# EasyEDA Pro project ProDoc_EthernetSwitch_2026-02-25.epro, board EthernetSwitch
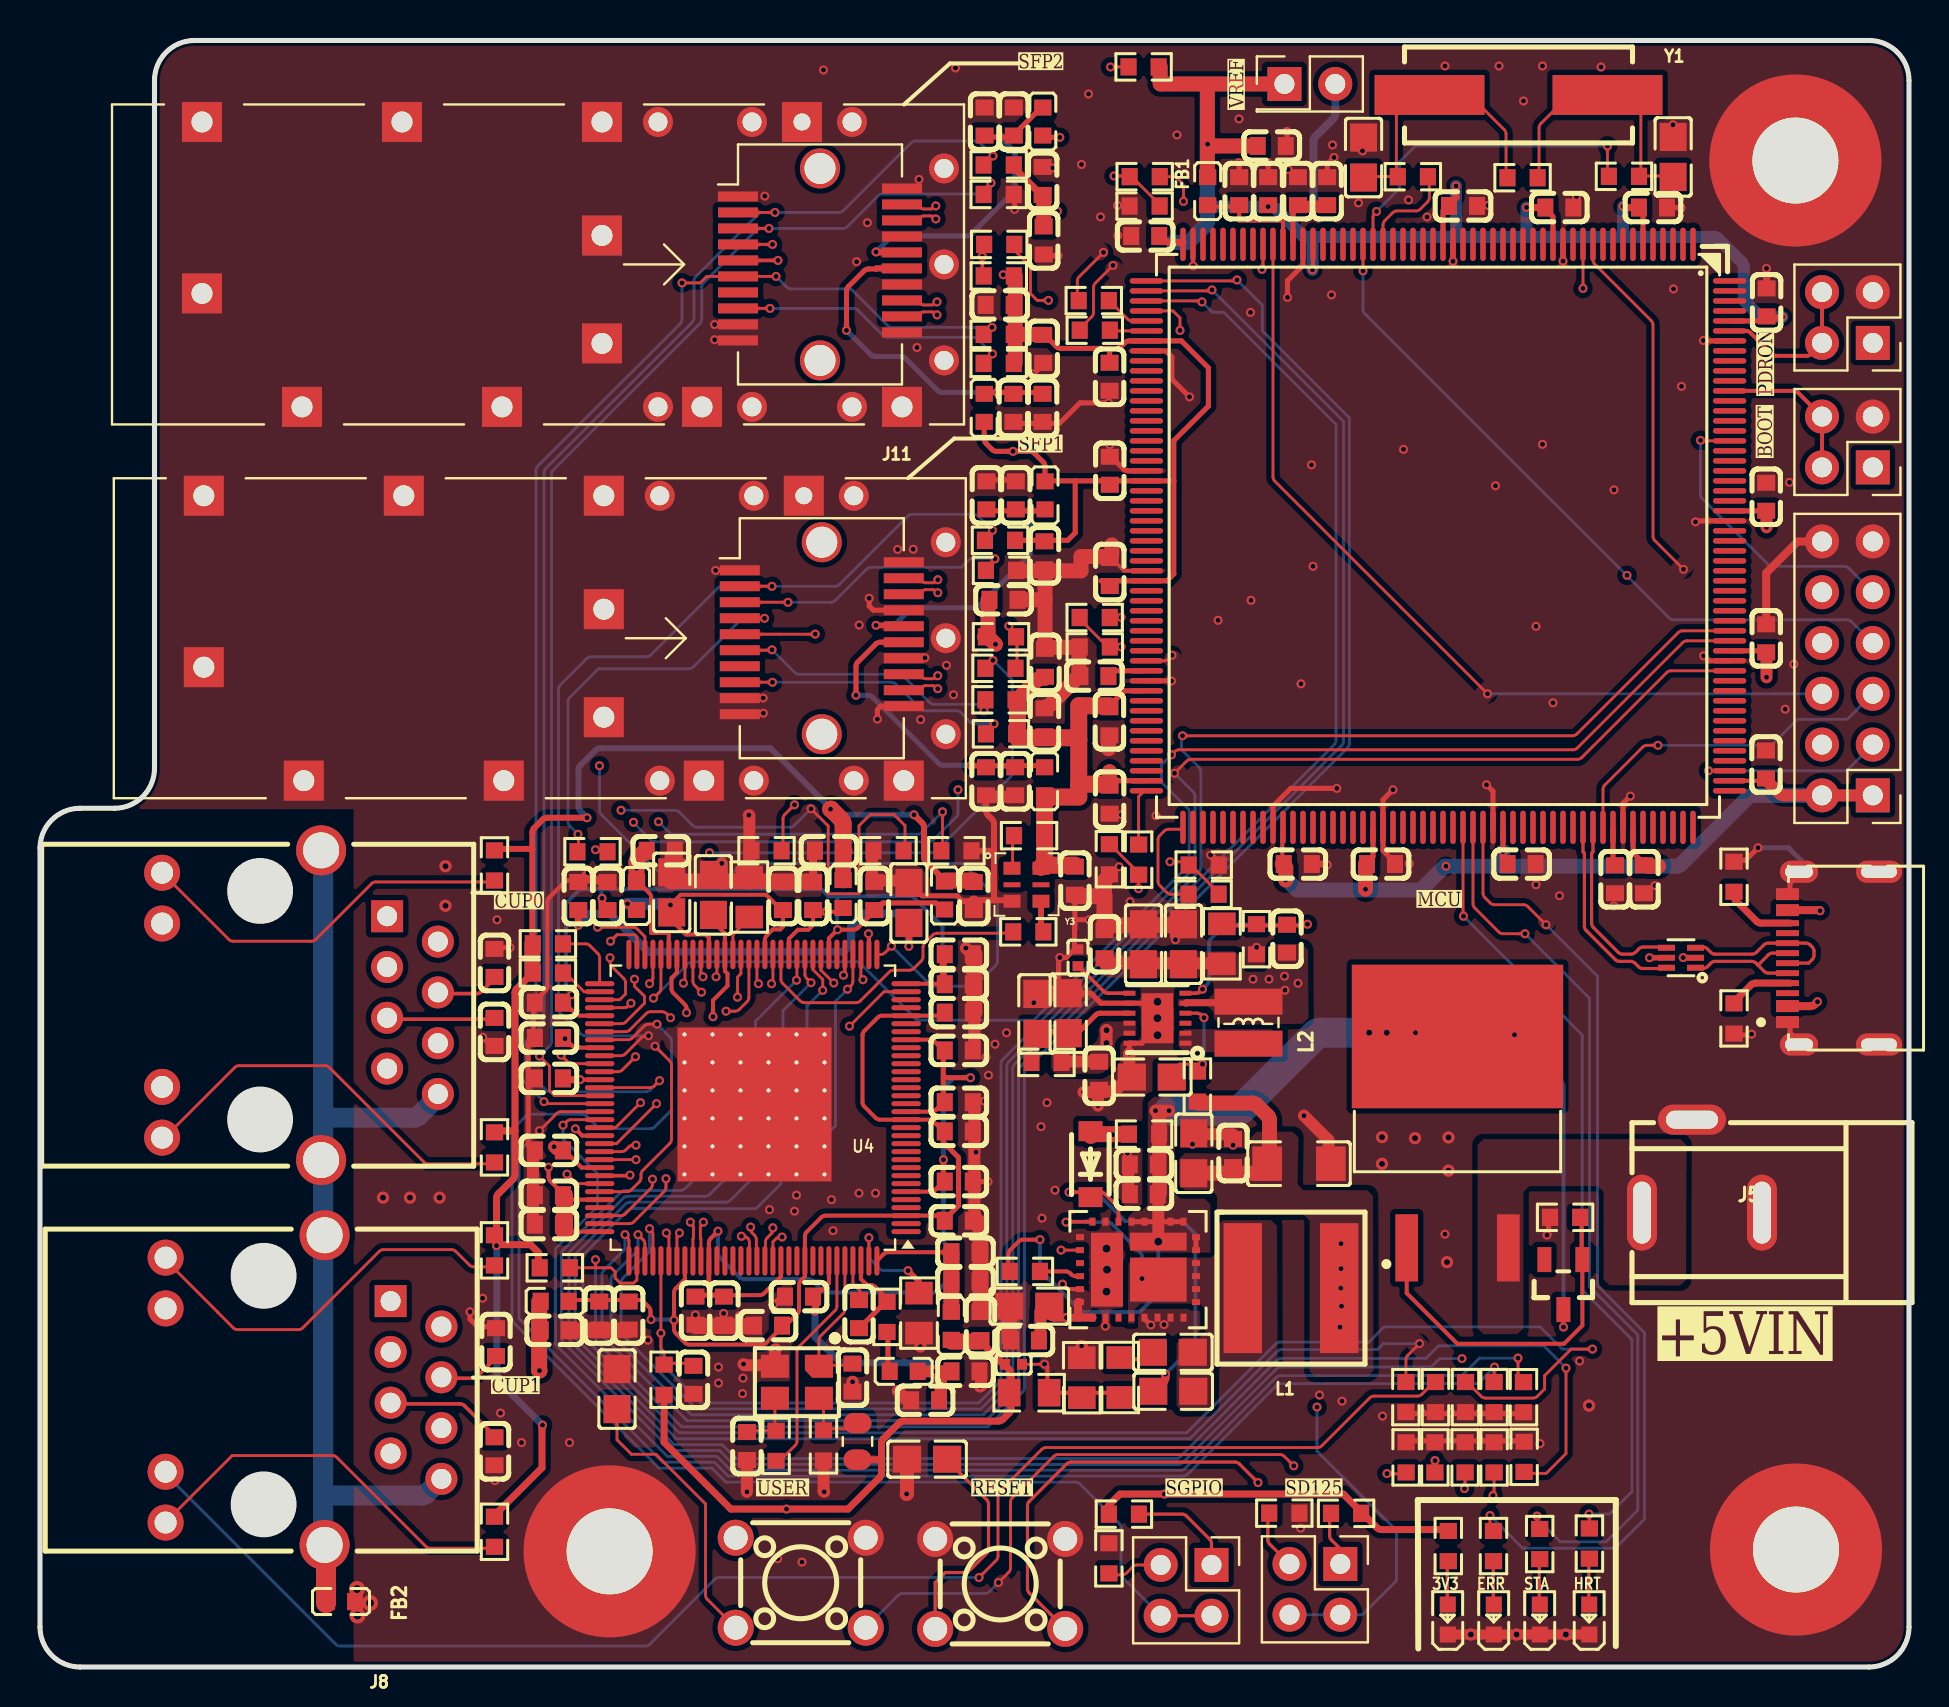
[diagram p3: board, top side]
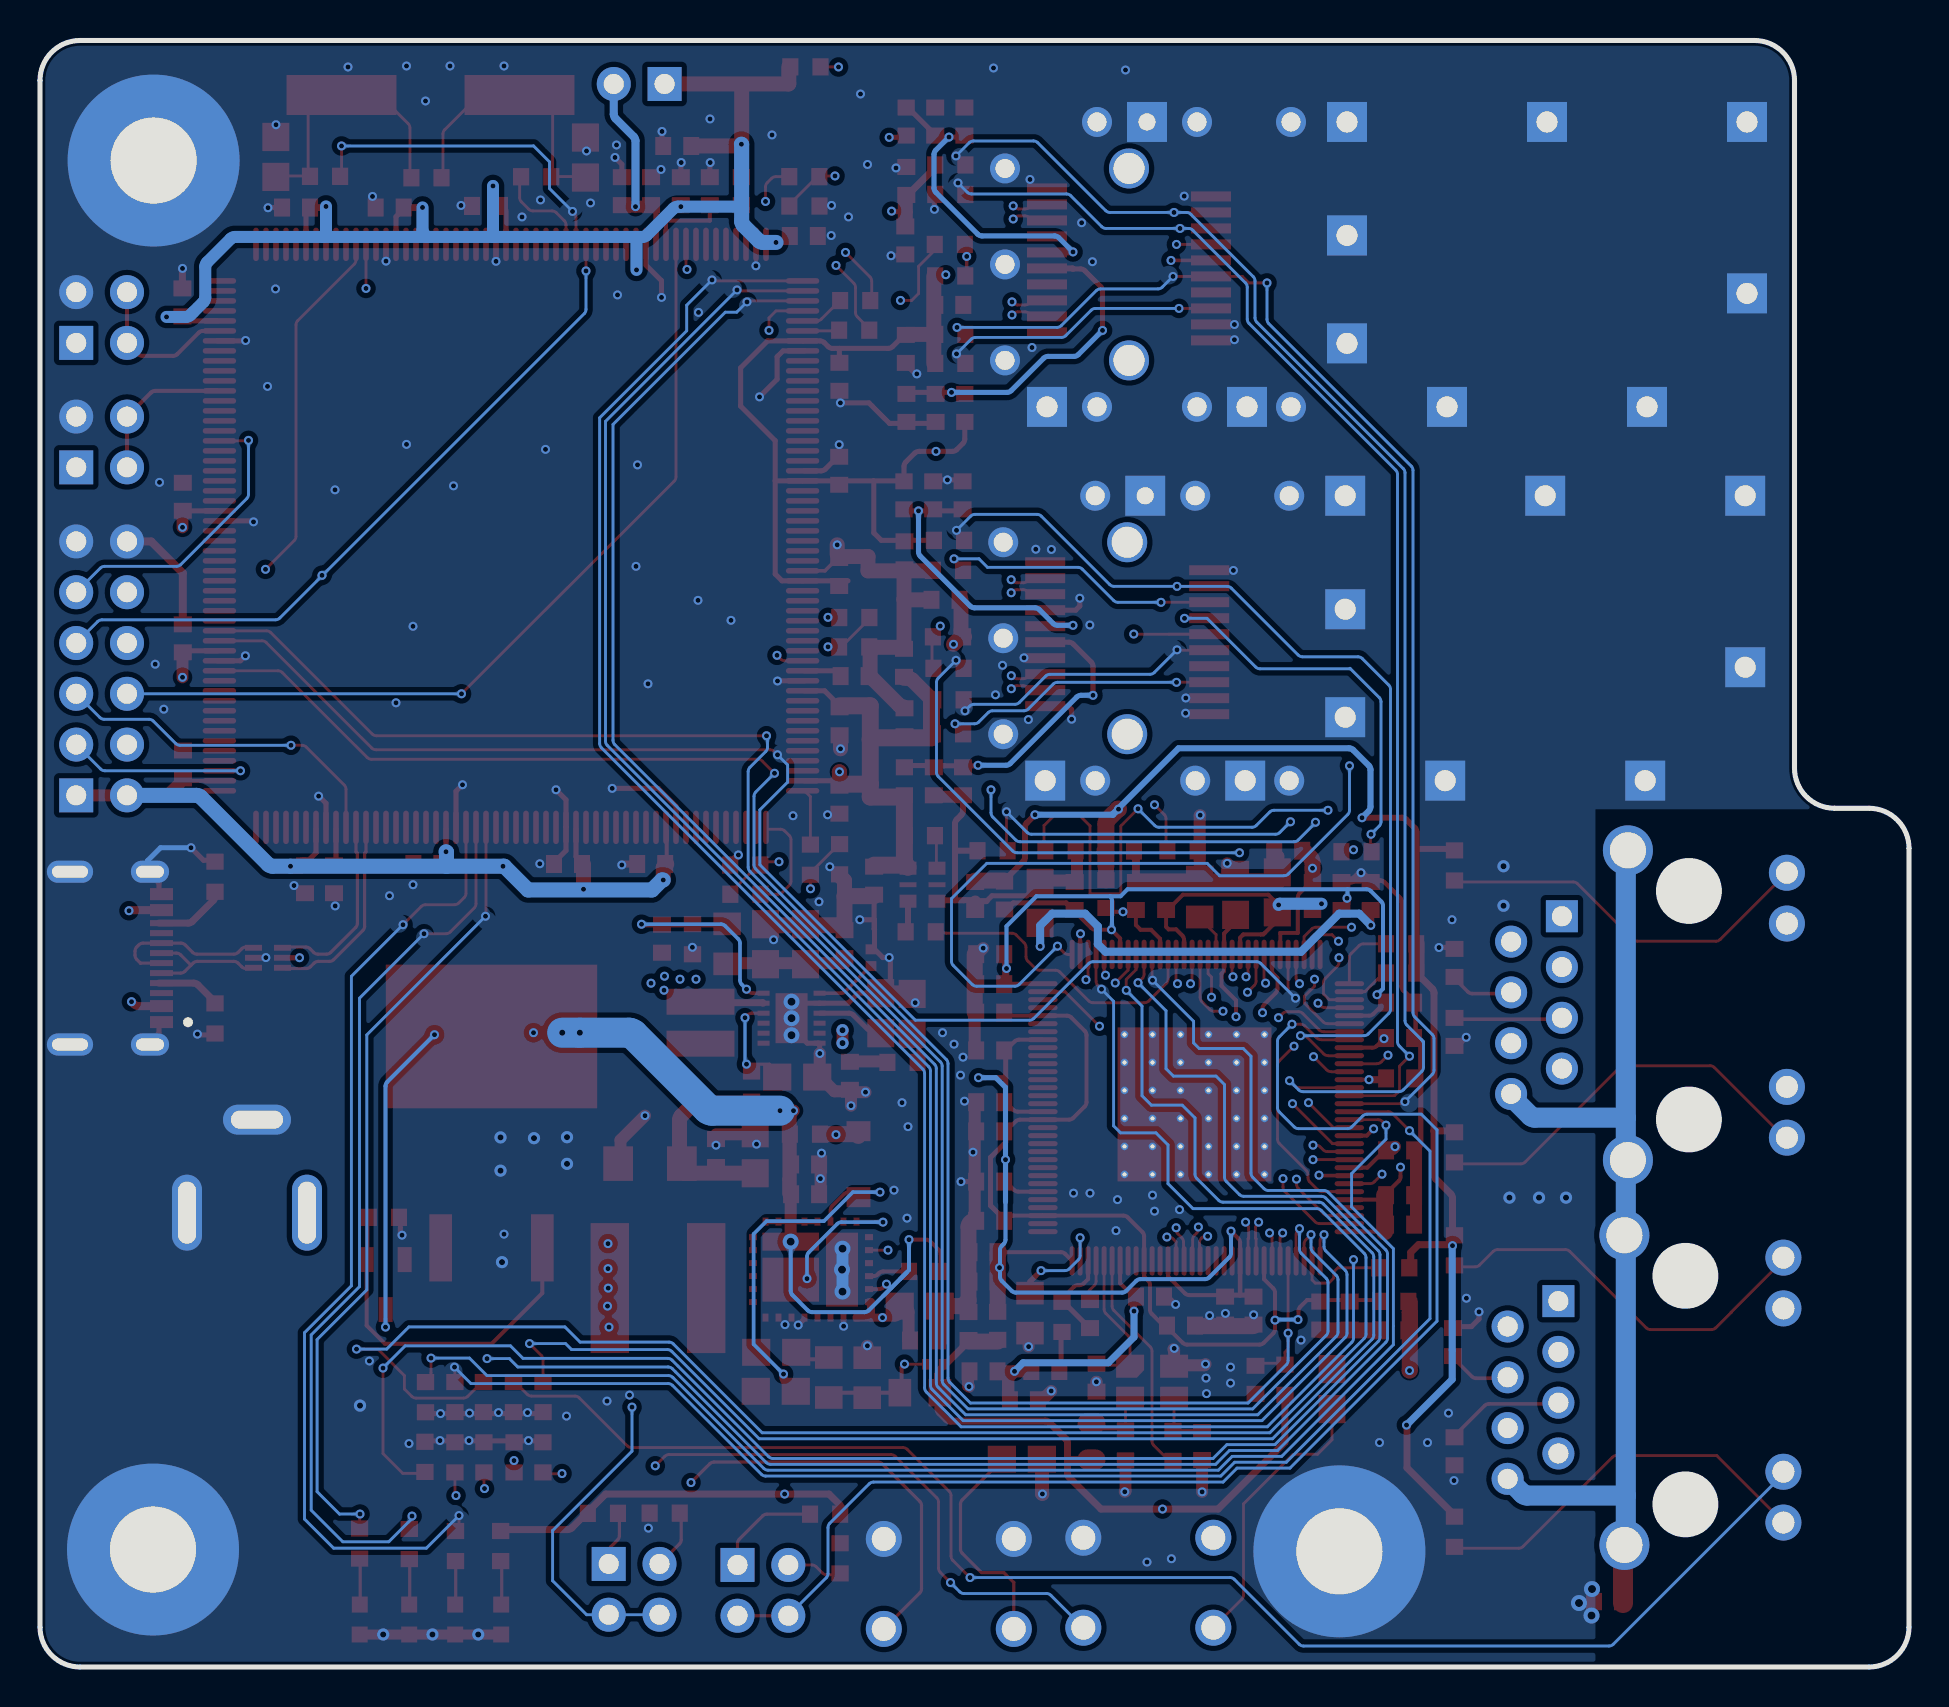
[diagram p4: board, bottom side, seen from below]

Outline 93.45 x 81.35 mm; copper layers: Top Layer, In1.Cu, In2.Cu, In3.Cu, In4.Cu, Bottom Layer. Coordinates in mm from the lower left corner of the outline.
Outline path: 0,40.95 arc(0.59,42.36) 2,42.95 3.73,42.95 arc(5.14,43.54) 5.73,44.95 5.73,79.35 arc(6.31,80.76) 7.73,81.35 91.45,81.35 arc(92.86,80.76) 93.45,79.35 93.45,2 arc(92.86,0.59) 91.45,0 2,0 arc(0.59,0.59) 0,2 0,40.95
Stack: Top Layer 0.0009mm / dielectric 1 0.0025mm FR4 er 4.5 / In1.Cu 0.0004mm / dielectric 2 0.0139mm FR4 er 4.5 / In2.Cu 0.0004mm / dielectric 3 0.0025mm FR4 er 4.5 / In3.Cu 0.0009mm / dielectric 4 0.0139mm FR4 er 4.5 / In4.Cu 0.0009mm / dielectric 5 0.0025mm FR4 er 4.5 / Bottom Layer 0.0009mm

## Design rules (mm)
template: Custom Config
spacing copperThickness1oz (default): track to track 0.102, other pairs 0.102 to 0.3
spacing copperThickness2oz: track to track 0.203, other pairs 0.152 to 0.3
spacing copperThicknessInner0.5oz: track to track 0.089, other pairs 0.152 to 0.3
track width copperThickness1oz (default): min 0.102, default 0.254, max 2.54
track width copperThickness0.5oz: min 0.089, default 0.254, max 2.54
track width copperThickness2oz: min 0.203, default 0.254, max 2.54
differential pair differentialPair (default): width min 0.127, default 0.254, max 2.54; gap min 0.152, default 0.152
via viaSize (default): diameter min 0.3, default 0.61, max 10; hole min 0.2, default 0.305, max 6.3

## Placement (name value [footprint] x y rotation side)
C1  100nf  [C0603]  80.65 73 0 top
C2  1uF  [C0603]  61.59 76.08 0 top
C3  4.7uF  [C0603]  55.19 25.14 180 top
C4  1uF  [C0805]  49.47 18.05 180 top
C5  100nf  [C0603]  75.97 73 0 top
C6  20pF  [C0805]  66.18 75.5 270 top
C7  20pF  [C0805]  81.66 75.53 270 top
C8  4.7uF  [C0603]  55.19 23.65 180 top
C9  100nf  [C0603]  71.15 73.08 0 top
C10  100nf  [C0603]  59.96 73.82 90 top
C11  100nf  [C0603]  61.41 73.82 90 top
C12  2.2uF  [C0603]  52.72 49.56 180 top
C13  100nf  [C0603]  55.26 71.57 180 top
C14  100nf  [C0603]  53.48 64.53 270 top
C15  2.2uF  [C0603]  78.75 39.4 270 top
C16  100nf  [C0603]  53.49 59.83 90 top
C17  100nf  [C0805]  56.66 13.79 180 top
C18  100nf  [C0603]  62.89 40.16 0 top
C19  2.2uF  [C0603]  49.25 16.33 180 top
C20  100nf  [C0805]  44.36 10.39 0 top
C21  100nf  [C0805]  56.64 15.74 180 top
C22  100nf  [C0603]  67.05 40.16 0 top
C23  4700pF  [C0402]  48.68 15.14 0 top
C24  100nf  [C0603]  80.2 39.4 270 top
C25  1uF  [C0603]  64.36 73.82 90 top
C26  100nf  [C0603]  86.3 45.14 90 top
C27  100nf  [C0603]  62.9 73.82 90 top
C28  100nf  [C0805]  28.85 13.9 270 top
C29  100uF  [C1206]  62.95 25.18 0 top
C30  100nf  [C0603]  53.48 43.38 270 top
C31  100nf  [C0603]  53.47 47.3 270 top
C32  100nf  [C0805]  57.69 25.7 90 top
C33  100nf  [C0603]  53.49 54.77 90 top
C34  10uF DNP  [C0603]  59.65 25.71 90 top
C35  100nf  [C0603]  86.31 51.45 90 top
C36  100nf  [C0603]  86.31 58.53 90 top
C37  100nF  [C0603]  40.95 17.65 90 top
C38  100nF  [C0603]  32.67 14.36 270 top
C39  1uF  [C0805]  55.59 29.51 180 top
C40  100nF  [C0603]  25.73 16.84 0 top
C41  15pF  [C0603]  40.63 14.47 90 top
C42  10000pF  [C0402]  51.9 35.48 90 top
C43  100nf  [C0603]  38.66 38.56 90 top
C44  4.7uF  [C0603]  45.94 35.65 0 top
C45  4.7uF  [C0603]  52.95 29.57 270 top
C46  100nf  [C0805]  49.84 32.67 90 top
C47  100nf  [C0805]  33.67 38.62 90 top
C48  100nf  [C0603]  28.38 38.56 90 top
C49  100nf  [C0603]  22.73 31.77 270 top
C50  100nf  [C0603]  22.73 10.79 270 top
C51  1uF  [C0805]  51.41 32.7 90 top
C52  100nf  [C0603]  37.14 38.56 90 top
C53  100nf  [C0603]  41.71 38.56 90 top
C54  100nf  [C0603]  22.73 35.22 90 top
C55  100nf  [C0603]  22.8 16.25 90 top
C56  15pF  [C0603]  35.35 11.05 90 top
C57  100nF  [C0603]  31.04 40.83 0 top
C58  100nf  [C0805]  31.58 38.74 90 top
C59  100nf  [C0603]  45.94 34.15 0 top
C60  100nf  [C0603]  25.45 33.23 180 top
C61  100nf  [C0603]  25.45 23.6 180 top
C62  100nF  [C0603]  46.27 14.79 0 top
C63  100nf  [C0603]  25.45 29.44 180 top
C64  33pF  [C0603]  62.35 36.43 90 top
C65  100nF  [C0603]  50.19 71.35 270 top
C66  100nF  [C0603]  47.98 68.12 180 top
C67  100nf  [C0603]  25.45 22.13 180 top
C68  22uF  [C0805]  57.17 36.15 90 top
C69  10uF  [C0603]  50.14 74.33 90 top
C70  10uF  [C0603]  50.16 65.93 270 top
C71  22uF  [C0805]  55.17 36.15 90 top
C72  100nF  [C0603]  46.69 38.56 270 top
C73  100nF  [C0603]  47.23 77.3 90 top
C74  100nF  [C0603]  50.13 62.98 270 top
C75  100nf  [C0603]  53.23 36.15 90 top
C76  10uF  [C0603]  48.69 77.3 90 top
C77  10uF  [C0603]  48.67 62.98 270 top
C78  4.7uF  [C0603]  46.27 19.28 0 top
C79  100nf  [C0603]  45.94 24.28 0 top
C80  4.7uF  [C0603]  27.96 17.58 270 top
C81  4.7uF  [C0603]  44.26 13.34 180 top
C82  100nF  [C0603]  47.02 17.05 90 top
C83  100nf  [C0603]  51.74 39.33 270 top
C84  100nf  [C0603]  45.94 30.84 0 top
C85  100nf  [C0603]  45.94 22.32 0 top
C86  100nf  [C0603]  26.92 38.56 90 top
C87  100nF  [C0603]  50.23 47.25 90 top
C88  100nF  [C0603]  48.17 53.38 0 top
C89  100nf  [C0603]  45.94 28.25 0 top
C90  100nf  [C0603]  45.94 26.79 0 top
C91  100nf  [C0603]  37.95 18.53 180 top
C92  10uF  [C0603]  50.25 50.23 90 top
C93  10uF  [C0603]  50.23 55.6 270 top
C94  100nf  [C0603]  32.77 17.83 270 top
C95  100nf  [C0603]  25.45 25.84 180 top
C96  100nf  [C0603]  45.94 32.73 0 top
C97  100nF  [C0603]  39.45 40.83 180 top
C98  100nf  [C0603]  34.2 17.83 270 top
C99  100nf  [C0603]  25.45 31.46 180 top
C100  100nf  [C0603]  29.44 17.58 270 top
C101  100nf  [C0603]  46.27 20.75 0 top
C102  100nf  [C0805]  43.45 38.22 90 top
C103  100nf  [C0603]  36.4 17.08 180 top
C104  100nF  [C0603]  48.76 44.3 270 top
C105  100nF  [C0603]  47.32 58.6 90 top
C106  10uF  [C0603]  47.3 44.3 270 top
C107  10uF  [C0603]  48.79 58.6 90 top
C108  100nf  [C0603]  74.08 40.16 0 top
C109  100nf  [C0603]  86.33 68.25 90 top
D1  NCD0805G1  [LED0603-RD]  70.39 2.38 90 top
D2  NCD0805R1  [LED0603-RD]  72.69 2.38 90 top
D3  SZYY0805B  [LED0603-RD]  74.99 2.38 90 top
D4  LTST-C170KFKT  [LED0603-RD_RED]  77.46 2.38 90 top
D5  PMEG2010AEH  [SOD-123F_L2.8-W1.8-LS3.7-RD]  52.52 25.15 90 top
D6  BZX84C12  [SOT-23-3_L2.9-W1.3-P1.90-LS2.4-TL]  76.17 19.13 270 top
FB1  220Ω@100MHz  [L0603]  58.38 73.82 90 top
FB2  600 Ω  [L0603]  15.05 3.28 0 top
FB4  33 Ω @ 100 MHz, 3 A  [L0603]  25.73 18.29 0 top
FB5  33 Ω @ 100 MHz, 3 A  [L0603]  29.83 38.56 270 top
FB6  33 Ω @ 100 MHz, 3 A  [L0603]  43.19 14.79 180 top
FB7  220 Ω  [L0603]  47.21 62.98 90 top
FB8  220 Ω  [L0603]  50.14 77.3 90 top
FB10  33 Ω @ 100 MHz, 3 A  [L0603]  45.23 38.59 270 top
FB11  33 Ω @ 100 MHz, 3 A  [L0603]  45.57 17.06 90 top
FB13  220 Ω  [L0603]  50.23 44.3 90 top
FB14  220 Ω  [L0603]  50.25 58.6 270 top
FB15  33 Ω @ 100 MHz, 3 A  [L0603]  40.16 38.66 270 top
H1  MountingHole_Pad  [MountingHole:MountingHole_4.3mm_M4_Pad]  87.77 75.34 0 top
H2  MountingHole_Pad  [MountingHole:MountingHole_4.3mm_M4_Pad]  28.48 5.78 0 top
H3  MountingHole_Pad  [MountingHole:MountingHole_4.3mm_M4_Pad]  87.8 5.88 0 top
J1  Conn_02x02_Row_Letter_Last  [Connector_PinHeader_2.54mm:PinHeader_2x02_P2.54mm_Vertical]  91.64 60 180 top
J2  Conn_02x06_Row_Letter_Last  [Connector_PinHeader_2.54mm:PinHeader_2x06_P2.54mm_Vertical]  91.64 43.59 180 top
J3  Conn_02x02_Row_Letter_Last  [Connector_PinHeader_2.54mm:PinHeader_2x02_P2.54mm_Vertical]  91.64 66.23 180 top
J4  Conn_02x01_Row_Letter_First  [Connector_PinHeader_2.54mm:PinHeader_2x01_P2.54mm_Vertical]  62.22 79.18 0 top
J5  Barrel_Jack_Switch  [DC-IN-TH_DC-005-A200]  83.1 25.05 180 top
J7  RJ45_Hanrun_HR911105A_Horizontal  [RJ45-TH_HR911105A]  13 33.1 270 top
J8  RJ45_Hanrun_HR911105A_Horizontal  [RJ45-TH_HR911105A]  13.17 13.85 270 top
J9  SFP  [Connector:Connector_SFP_and_Cage]  45.2 70.15 0 top
J10  Conn_02x02_Row_Letter_Last  [Connector_PinHeader_2.54mm:PinHeader_2x02_P2.54mm_Vertical]  58.58 5.11 270 top
J11  SFP  [Connector:Connector_SFP_and_Cage]  45.29 51.46 0 top
J12  Conn_02x02_Row_Letter_Last  [Connector_PinHeader_2.54mm:PinHeader_2x02_P2.54mm_Vertical]  65.02 5.16 270 top
J13  USB4215-03-A  [USB4215-03-A:CONN_8p94X6p5X3p16_12L_GCC]  90.8 35.46 90 top
L1  XAL7070-682MEC  [IND-SMD_L7.5-W7.2-1]  62.55 18.95 0 top
L2  NR3015T1R0N  [IND-SMD_L3.0-W3.0-SPM3020-2R2M]  60.42 32.23 90 top
Q1  IRF4905STRLPBF  [D2PAK_L9.1-W10.0-P2.54-LS15.3-TL]  70.88 26.25 90 top
R1  1kΩ  [R0603]  70.42 6.05 270 top
R2  1kΩ  [R0603]  72.67 6.05 270 top
R3  10kΩ  [R0603]  49.24 19.78 0 top
R4  0Ω  [R0603]  55.2 26.65 0 top
R5  10MΩ  [R0603]  74.13 74.48 0 top
R6  0Ω  [R0603]  68.64 74.54 0 top
R7  0Ω  [R0603]  79.2 74.56 180 top
R8  1kΩ  [R0603]  74.98 6.15 270 top
R9  1kΩ  [R0603]  77.47 6.18 270 top
R10  19.1kΩ  [R0805]  54.01 14.48 90 top
R11  8.2kΩ 1%  [R0805]  49.46 13.72 180 top
R12  2.61kΩ 1%  [R0805]  52.09 14.47 270 top
R13  5.1kΩ  [R0603]  84.7 32.44 270 top
R14  10kΩ  [R0603]  76.26 22.49 180 top
R15  5.1kΩ  [R0603]  84.7 39.53 90 top
R16  3.3KΩ  [R0603]  48.05 51.53 180 top
R17  3.3KΩ  [R0603]  47.94 69.58 0 top
R18  3.3KΩ  [R0603]  55.18 80.03 0 top
R19  10Ω  [R0603]  42.35 17.51 90 top
R20  22Ω  [R0603]  52.74 66.86 180 top
R21  22Ω  [R0603]  58.18 38.65 0 top
R22  22Ω  [R0603]  54.93 40.38 270 top
R23  22Ω  [R0603]  52.73 52.49 180 top
R24  22Ω  [R0603]  55.23 74.54 180 top
R25  22Ω  [R0603]  48.02 49.95 180 top
R26  22Ω  [R0603]  47.96 71.15 0 top
R27  22Ω  [R0603]  27.63 40.78 0 top
R28  22Ω  [R0603]  52.69 68.34 180 top
R29  200Ω@1%  [R0805]  35.46 38.51 270 top
R30  6kΩ@1%  [R0805]  43.95 17.7 90 top
R31  100kΩ  [R0603]  31.2 14.37 270 top
R32  470Ω  [R0603]  22.73 6.77 90 top
R33  470Ω  [R0603]  22.73 20.84 90 top
R34  470Ω  [R0603]  22.73 25.99 90 top
R35  470Ω  [R0603]  22.73 40.09 90 top
R36  10KΩ  [R0603]  25.74 19.97 0 top
R37  10KΩ  [R0603]  57.87 29.03 270 top
R38  0Ω  [R0603]  39.17 11.08 90 top
R39  1kΩ  [R0603]  72.7 13.5 90 top
R40  1kΩ  [R0603]  74.17 13.5 90 top
R41  1kΩ  [R0603]  58.19 40.11 180 top
R42  1kΩ  [R0603]  53.47 40.4 90 top
R43  1kΩ  [R0603]  52.74 51.02 0 top
R44  1kΩ  [R0603]  55.23 73.07 0 top
R45  DNP  [Resistor_SMD:R_0805_2012Metric]  40.88 11.28 270 top
R46  10Ω  [R0603]  50.33 30.24 0 top
R47  0Ω  [R0603]  36.8 11.06 270 top
R48  10KΩ  [R0603]  47.94 66.65 0 top
R49  1kΩ  [R0603]  74.2 10.51 270 top
R50  1kΩ  [R0603]  42.42 40.83 0 top
R51  1kΩ  [R0603]  36.33 40.83 0 top
R52  1kΩ  [R0603]  45.82 40.83 180 top
R53  1kΩ  [R0603]  68.3 13.5 90 top
R54  1kΩ  [R0603]  69.77 13.5 90 top
R55  1kΩ  [R0603]  71.27 13.5 90 top
R56  232kΩ  [R0805]  59.1 36.17 270 top
R57  270kΩ  [R0603]  60.83 36.4 90 top
R58  1kΩ  [R0603]  47.94 73.65 180 top
R59  10KΩ  [R0603]  47.94 65.2 0 top
R60  10KΩ  [R0603]  49.45 41.58 180 top
R61  10KΩ  [R0603]  47.94 75.12 0 top
R62  1kΩ  [R0603]  72.7 10.49 270 top
R63  1kΩ  [R0603]  71.26 10.49 270 top
R64  1kΩ  [R0603]  68.3 10.49 270 top
R65  1kΩ  [R0603]  69.74 10.49 270 top
R66  10KΩ  [R0603]  54.2 7.65 0 top
R67  1kΩ  [R0603]  53.45 5.44 270 top
R68  10KΩ  [R0603]  48.02 48.38 0 top
R69  22Ω  [R0603]  49.42 36.77 0 top
R70  1kΩ  [R0603]  48.05 54.85 180 top
R71  1kΩ  [R0603]  62.21 7.69 180 top
R72  10KΩ  [R0603]  65.3 7.69 180 top
R73  10KΩ  [R0603]  25.39 34.71 180 top
R74  10KΩ  [R0603]  25.39 36.17 180 top
R75  10KΩ  [R0603]  48.05 46.68 0 top
R76  10KΩ  [R0603]  48 56.35 0 top
SW1  1825910-6  [SW-TH_4P-L6.0-W6.0-P4.50-LS6.5]  48.01 4.16 0 top
SW2  1825910-6  [SW-TH_4P-L6.0-W6.0-P4.50-LS6.5]  38.04 4.22 0 top
U1  STM32H743BIT6  [LQFP-208_L28.0-W28.0-P0.50-LS30.0-BL]  69.9 56.58 180 top
U2  MIC24051YJL-TR  [MIC24051:QFN28_5X6_MCH]  54.9 19.88 90 top
U3  USBLC6-2P6  [SOT-666-6_L1.6-W1.2-P0.50-LS1.6-BR]  82.05 35.47 0 top
U4  LN96459  [Library:128-TQFP]  35.73 28.14 180 top
U5  MIC23303YML-TR  [TDFN-12_L3.0-W3.0-P0.50-BL-EP]  55.87 32.45 90 top
Y1  8Mhz  [CRYSTAL-SMD_L11.5-W4.8-LS12.7]  73.92 78.62 180 top
Y2  ABM8G-25.000MHZ-B4Y-T  [CRYSTAL-SMD_4P-L3.2-W2.5-TR]  37.85 14.24 0 top
Y3  DSC1101BI2-125.0000  [Library:6-VDFN]  49.27 39.1 270 top

## Footprints (pads in the part's own frame, mm; a bottom-side part is the same pattern mirrored in y, then rotated)
C0402
  rect 0.5x0.54 smd: 1(-0.42,0) 2(0.42,0)
C0603
  rect 0.8x0.9 smd: 1(-0.7,0) 2(0.7,0)
C0805
  rect 1.41x1.35 smd: 1(-1,0) 2(1,0)
C1206
  rect 1.485x1.728 smd: 1(-1.593,0) 2(1.593,0)
Connector:Connector_SFP_and_Cage
  round 2 hole 1.55: (-6.2,4.8) (-6.2,-4.8)
  rect 2x0.5 smd: 1(-10.3,3.4) 2(-10.3,2.6) 3(-10.3,1.8) 4(-10.3,1) 5(-10.3,0.2) 6(-10.3,-0.6) 7(-10.3,-1.4) 8(-10.3,-2.2) 9(-10.3,-3) 10(-10.3,-3.8) 11(-2.1,-3.4) 12(-2.1,-2.6) 13(-2.1,-1.8) 14(-2.1,-1) 15(-2.1,-0.2) 16(-2.1,0.6) 17(-2.1,1.4) 18(-2.1,2.2) 19(-2.1,3) 20(-2.1,3.8)
  rect 2x2 hole 1.05: CAGE(-37.1,7.125) CAGE(-37.1,-1.45) CAGE(-32.1,-7.125) CAGE(-27.1,7.125) CAGE(-22.1,-7.125) CAGE(-17.1,7.125) CAGE(-17.1,1.45) CAGE(-17.1,-3.95) CAGE(-12.1,-7.125) CAGE(-2.1,-7.125)
  round 1.5 hole 0.95: CAGE(-14.3,7.125) CAGE(-14.3,-7.125) CAGE(-9.6,7.125) CAGE(-9.6,-7.125) CAGE(-4.6,7.125) CAGE(-4.6,-7.125) CAGE(0,4.8) CAGE(0,0) CAGE(0,-4.8)
  rect 2x2 hole 0.85: CAGE(-7.1,7.125)
Connector_PinHeader_2.54mm:PinHeader_2x01_P2.54mm_Vertical
  rect 1.7x1.7 hole 1: 1(0,0)
  round 1.7 hole 1: 2(2.54,0)
Connector_PinHeader_2.54mm:PinHeader_2x02_P2.54mm_Vertical
  rect 1.7x1.7 hole 1: 1(0,0)
  round 1.7 hole 1: 2(2.54,0) 3(0,-2.54) 4(2.54,-2.54)
Connector_PinHeader_2.54mm:PinHeader_2x06_P2.54mm_Vertical
  rect 1.7x1.7 hole 1: 1(0,0)
  round 1.7 hole 1: 2(2.54,0) 3(0,-2.54) 4(2.54,-2.54) 5(0,-5.08) 6(2.54,-5.08) 7(0,-7.62) 8(2.54,-7.62) 9(0,-10.16) 10(2.54,-10.16) 11(0,-12.7) 12(2.54,-12.7)
CRYSTAL-SMD_4P-L3.2-W2.5-TR
  custom 1.4x1.15 smd: 1(1.1,0.8)
  rect 1.4x1.15 smd: 2(-1.1,0.8) 3(-1.1,-0.8) 4(1.1,-0.8)
CRYSTAL-SMD_L11.5-W4.8-LS12.7
  rect 5.5x2 smd: 1(-4.45,0) 2(4.45,0)
D2PAK_L9.1-W10.0-P2.54-LS15.3-TL
  rect 3.358x1.134 smd: 1(-5.286,2.54) 3(-5.286,-2.54)
  rect 7.181x10.566 smd: 4(5.286,0)
DC-IN-TH_DC-005-A200
  oval 1.5x3.8 hole 0.9x3.1: 1(3,2.325) 2(-3,2.325)
  oval 3.4x1.5 hole 2.6x0.9: 3(0.5,-2.325)
IND-SMD_L3.0-W3.0-SPM3020-2R2M
  rect 1.3x3.4 smd: 1(1.05,0) 2(-1.05,0)
IND-SMD_L7.5-W7.2-1
  rect 1.92x6.5 smd: 1(-2.41,0) 2(2.41,0)
L0603
  rect 0.8x0.864 smd: 1(-0.7,0) 2(0.7,0)
LED0603-RD
  rect 0.8x0.8 smd: 1(-0.749,0) 2(0.749,0)
LED0603-RD_RED
  rect 0.8x0.8 smd: 1(-0.749,-0.004) 2(0.749,0.004)
Library:6-VDFN
  rect 0.65x0.85 smd: 1(-0.85,-0.675) 3(0.8,-0.675) 4(0.8,0.775) 6(-0.85,0.775)
  rect 0.25x0.85 smd: 2(-0.025,-0.675) 5(-0.025,0.775)
Library:128-TQFP
  rrect 1.475x0.25 smd: 1(-7.582,6.362) 2(-7.582,5.963) 3(-7.582,5.562) 4(-7.582,5.162) 5(-7.582,4.763) 6(-7.582,4.362) 7(-7.582,3.962) 8(-7.582,3.562) 9(-7.582,3.163) 10(-7.582,2.763) 11(-7.582,2.362) 12(-7.582,1.962) 13(-7.582,1.562) 14(-7.582,1.163) 15(-7.582,0.762) 16(-7.582,0.362) 17(-7.582,-0.037) 18(-7.582,-0.438) 19(-7.582,-0.838) 20(-7.582,-1.238) 21(-7.582,-1.637) 22(-7.582,-2.038) 23(-7.582,-2.438) 24(-7.582,-2.837) 25(-7.582,-3.237) 26(-7.582,-3.638) 27(-7.582,-4.037) 28(-7.582,-4.438) 29(-7.582,-4.838) 30(-7.582,-5.237) 31(-7.582,-5.638) 32(-7.582,-6.037) 65(7.742,-6.037) 66(7.742,-5.638) 67(7.742,-5.237) 68(7.742,-4.838) 69(7.742,-4.438) 70(7.742,-4.037) 71(7.742,-3.638) 72(7.742,-3.237) 73(7.742,-2.837) 74(7.742,-2.438) 75(7.742,-2.038) 76(7.742,-1.637) 77(7.742,-1.238) 78(7.742,-0.838) 79(7.742,-0.438) 80(7.742,-0.037) 81(7.742,0.362) 82(7.742,0.762) 83(7.742,1.163) 84(7.742,1.562) 85(7.742,1.962) 86(7.742,2.362) 87(7.742,2.763) 88(7.742,3.163) 89(7.742,3.562) 90(7.742,3.962) 91(7.742,4.362) 92(7.742,4.763) 93(7.742,5.162) 94(7.742,5.562) 95(7.742,5.963) 96(7.742,6.362)
  rrect 0.25x1.475 smd: 33(-6.12,-7.5) 34(-5.72,-7.5) 35(-5.32,-7.5) 36(-4.92,-7.5) 37(-4.52,-7.5) 38(-4.12,-7.5) 39(-3.72,-7.5) 40(-3.32,-7.5) 41(-2.92,-7.5) 42(-2.52,-7.5) 43(-2.12,-7.5) 44(-1.72,-7.5) 45(-1.32,-7.5) 46(-0.92,-7.5) 47(-0.52,-7.5) 48(-0.12,-7.5) 49(0.28,-7.5) 50(0.68,-7.5) 51(1.08,-7.5) 52(1.48,-7.5) 53(1.88,-7.5) 54(2.28,-7.5) 55(2.68,-7.5) 56(3.08,-7.5) 57(3.48,-7.5) 58(3.88,-7.5) 59(4.28,-7.5) 60(4.68,-7.5) 61(5.08,-7.5) 62(5.48,-7.5) 63(5.88,-7.5) 64(6.28,-7.5) 97(6.28,7.825) 98(5.88,7.825) 99(5.48,7.825) 100(5.08,7.825) 101(4.68,7.825) 102(4.28,7.825) 103(3.88,7.825) 104(3.48,7.825) 105(3.08,7.825) 106(2.68,7.825) 107(2.28,7.825) 108(1.88,7.825) 109(1.48,7.825) 110(1.08,7.825) 111(0.68,7.825) 112(0.28,7.825) 113(-0.12,7.825) 114(-0.52,7.825) 115(-0.92,7.825) 116(-1.32,7.825) 117(-1.72,7.825) 118(-2.12,7.825) 119(-2.52,7.825) 120(-2.92,7.825) 121(-3.32,7.825) 122(-3.72,7.825) 123(-4.12,7.825) 124(-4.52,7.825) 125(-4.92,7.825) 126(-5.32,7.825) 127(-5.72,7.825) 128(-6.12,7.825)
  round 0.38 hole 0.2x0.33: 129(-3.5,3.5) 129(-3.5,2.1) 129(-3.5,0.7) 129(-3.5,-0.7) 129(-3.5,-2.1) 129(-3.5,-3.5) 129(-2.1,2.1) 129(-2.1,0.7) 129(-2.1,-0.7) 129(-2.1,-2.1) 129(-2.1,-3.5) 129(-0.7,2.1) 129(-0.7,0.7) 129(-0.7,-0.7) 129(-0.7,-2.1) 129(-0.7,-3.5) 129(0.7,2.1) 129(0.7,0.7) 129(0.7,-0.7) 129(0.7,-2.1) 129(0.7,-3.5) 129(2.1,2.1) 129(2.1,0.7) 129(2.1,-0.7) 129(2.1,-2.1) 129(2.1,-3.5) 129(3.5,2.1) 129(3.5,0.7) 129(3.5,-0.7) 129(3.5,-2.1) 129(3.5,-3.5)
  round 0.38 hole 0.33x0.2: 129(-2.1,3.5) 129(-0.7,3.5) 129(0.7,3.5) 129(2.1,3.5) 129(3.5,3.5)
  rect 7.7x7.7 smd: 129(0,0)
LQFP-208_L28.0-W28.0-P0.50-LS30.0-BL
  oval 0.28x1.67 smd: 1(-12.75,-14.58) 2(-12.25,-14.58) 3(-11.75,-14.58) 4(-11.25,-14.58) 5(-10.75,-14.58) 6(-10.25,-14.58) 7(-9.75,-14.58) 8(-9.25,-14.58) 9(-8.75,-14.58) 10(-8.25,-14.58) 11(-7.75,-14.58) 12(-7.25,-14.58) 13(-6.75,-14.58) 14(-6.25,-14.58) 15(-5.75,-14.58) 16(-5.25,-14.58) 17(-4.75,-14.58) 18(-4.25,-14.58) 19(-3.75,-14.58) 20(-3.25,-14.58) 21(-2.75,-14.58) 22(-2.25,-14.58) 23(-1.75,-14.58) 24(-1.25,-14.58) 25(-0.75,-14.58) 26(-0.25,-14.58) 27(0.25,-14.58) 28(0.75,-14.58) 29(1.25,-14.58) 30(1.75,-14.58) 31(2.25,-14.58) 32(2.75,-14.58) 33(3.25,-14.58) 34(3.75,-14.58) 35(4.25,-14.58) 36(4.75,-14.58) 37(5.25,-14.58) 38(5.75,-14.58) 39(6.25,-14.58) 40(6.75,-14.58) 41(7.25,-14.58) 42(7.75,-14.58) 43(8.25,-14.58) 44(8.75,-14.58) 45(9.25,-14.58) 46(9.75,-14.58) 47(10.25,-14.58) 48(10.75,-14.58) 49(11.25,-14.58) 50(11.75,-14.58) 51(12.25,-14.58) 52(12.75,-14.58) 105(12.75,14.58) 106(12.25,14.58) 107(11.75,14.58) 108(11.25,14.58) 109(10.75,14.58) 110(10.25,14.58) 111(9.75,14.58) 112(9.25,14.58) 113(8.75,14.58) 114(8.25,14.58) 115(7.75,14.58) 116(7.25,14.58) 117(6.75,14.58) 118(6.25,14.58) 119(5.75,14.58) 120(5.25,14.58) 121(4.75,14.58) 122(4.25,14.58) 123(3.75,14.58) 124(3.25,14.58) 125(2.75,14.58) 126(2.25,14.58) 127(1.75,14.58) 128(1.25,14.58) 129(0.75,14.58) 130(0.25,14.58) 131(-0.25,14.58) 132(-0.75,14.58) 133(-1.25,14.58) 134(-1.75,14.58) 135(-2.25,14.58) 136(-2.75,14.58) 137(-3.25,14.58) 138(-3.75,14.58) 139(-4.25,14.58) 140(-4.75,14.58) 141(-5.25,14.58) 142(-5.75,14.58) 143(-6.25,14.58) 144(-6.75,14.58) 145(-7.25,14.58) 146(-7.75,14.58) 147(-8.25,14.58) 148(-8.75,14.58) 149(-9.25,14.58) 150(-9.75,14.58) 151(-10.25,14.58) 152(-10.75,14.58) 153(-11.25,14.58) 154(-11.75,14.58) 155(-12.25,14.58) 156(-12.75,14.58)
  oval 1.67x0.28 smd: 53(14.58,-12.75) 54(14.58,-12.25) 55(14.58,-11.75) 56(14.58,-11.25) 57(14.58,-10.75) 58(14.58,-10.25) 59(14.58,-9.75) 60(14.58,-9.25) 61(14.58,-8.75) 62(14.58,-8.25) 63(14.58,-7.75) 64(14.58,-7.25) 65(14.58,-6.75) 66(14.58,-6.25) 67(14.58,-5.75) 68(14.58,-5.25) 69(14.58,-4.75) 70(14.58,-4.25) 71(14.58,-3.75) 72(14.58,-3.25) 73(14.58,-2.75) 74(14.58,-2.25) 75(14.58,-1.75) 76(14.58,-1.25) 77(14.58,-0.75) 78(14.58,-0.25) 79(14.58,0.25) 80(14.58,0.75) 81(14.58,1.25) 82(14.58,1.75) 83(14.58,2.25) 84(14.58,2.75) 85(14.58,3.25) 86(14.58,3.75) 87(14.58,4.25) 88(14.58,4.75) 89(14.58,5.25) 90(14.58,5.75) 91(14.58,6.25) 92(14.58,6.75) 93(14.58,7.25) 94(14.58,7.75) 95(14.58,8.25) 96(14.58,8.75) 97(14.58,9.25) 98(14.58,9.75) 99(14.58,10.25) 100(14.58,10.75) 101(14.58,11.25) 102(14.58,11.75) 103(14.58,12.25) 104(14.58,12.75) 157(-14.58,12.75) 158(-14.58,12.25) 159(-14.58,11.75) 160(-14.58,11.25) 161(-14.58,10.75) 162(-14.58,10.25) 163(-14.58,9.75) 164(-14.58,9.25) 165(-14.58,8.75) 166(-14.58,8.25) 167(-14.58,7.75) 168(-14.58,7.25) 169(-14.58,6.75) 170(-14.58,6.25) 171(-14.58,5.75) 172(-14.58,5.25) 173(-14.58,4.75) 174(-14.58,4.25) 175(-14.58,3.75) 176(-14.58,3.25) 177(-14.58,2.75) 178(-14.58,2.25) 179(-14.58,1.75) 180(-14.58,1.25) 181(-14.58,0.75) 182(-14.58,0.25) 183(-14.58,-0.25) 184(-14.58,-0.75) 185(-14.58,-1.25) 186(-14.58,-1.75) 187(-14.58,-2.25) 188(-14.58,-2.75) 189(-14.58,-3.25) 190(-14.58,-3.75) 191(-14.58,-4.25) 192(-14.58,-4.75) 193(-14.58,-5.25) 194(-14.58,-5.75) 195(-14.58,-6.25) 196(-14.58,-6.75) 197(-14.58,-7.25) 198(-14.58,-7.75) 199(-14.58,-8.25) 200(-14.58,-8.75) 201(-14.58,-9.25) 202(-14.58,-9.75) 203(-14.58,-10.25) 204(-14.58,-10.75) 205(-14.58,-11.25) 206(-14.58,-11.75) 207(-14.58,-12.25) 208(-14.58,-12.75)
MIC24051:QFN28_5X6_MCH
  rect 0.4x0.3 smd: 1(-2.4,2.275) 2(-2.4,1.625) 3(-2.4,0.975) 4(-2.4,0.325) 5(-2.4,-0.325) 6(-2.4,-0.975) 7(-2.4,-1.625) 8(-2.4,-2.275) 15(2.4,-2.275) 16(2.4,-1.625) 17(2.4,-0.975) 18(2.4,-0.325) 19(2.4,0.325) 20(2.4,0.975) 21(2.4,1.625) 22(2.4,2.275)
  rect 0.3x0.4 smd: 9(-1.625,-2.9) 10(-0.975,-2.9) 11(-0.325,-2.9) 12(0.325,-2.9) 13(0.975,-2.9) 14(1.625,-2.9) 23(1.625,2.9) 24(0.975,2.9) 25(0.325,2.9) 26(-0.325,2.9) 27(-0.975,2.9) 28(-1.625,2.9)
  rect 3.7x1.6 smd: 29(0,1.55)
  rect 2.2x2.83 smd: 30(-0.5,-1.015)
  rect 0.9x2.83 smd: 31(1.4,-1.015)
MountingHole:MountingHole_4.3mm_M4_Pad
  round 8.6 hole 4.3: 1(0,0)
R0603
  rect 0.806x0.864 smd: 1(-0.753,0) 2(0.753,0)
R0805
  rect 1.133x1.377 smd: 1(-1,0) 2(1,0)
Resistor_SMD:R_0805_2012Metric
  rrect 1.025x1.4 smd: 1(-0.912,0) 2(0.912,0)
RJ45-TH_HR911105A
  rect 1.6x1.6 hole 1: 1(-4.45,4.355)
  round 1.6 hole 1: 2(-3.18,6.895) 3(-1.91,4.355) 4(-0.64,6.895) 5(0.63,4.355) 6(1.9,6.895) 7(3.17,4.355) 8(4.44,6.895)
  round 1.8 hole 1.1: 9(-6.625,-6.895) 10(-4.085,-6.895) 11(4.085,-6.895) 12(6.625,-6.895)
  round 2.5 hole 1.8: SH1(-7.745,1.055) SH2(7.745,1.055)
SOD-123F_L2.8-W1.8-LS3.7-RD
  rect 1x1.2 smd: 1(-1.65,0) 2(1.65,0)
SOT-23-3_L2.9-W1.3-P1.90-LS2.4-TL
  rect 1.25x0.7 smd: 1(-1.25,0.95) 2(-1.25,-0.95) 3(1.25,0)
SOT-666-6_L1.6-W1.2-P0.50-LS1.6-BR
  rect 0.85x0.3 smd: 1(0.725,-0.5) 2(0.725,0) 3(0.725,0.5) 4(-0.725,0.5) 5(-0.725,0) 6(-0.725,-0.5)
SW-TH_4P-L6.0-W6.0-P4.50-LS6.5
  round 1.8 hole 1.2: 1(-3.25,2.25) 2(3.25,2.25) 3(-3.25,-2.25) 4(3.25,-2.25)
TDFN-12_L3.0-W3.0-P0.50-BL-EP
  rect 0.25x0.6 smd: 1(-1.25,-1.4) 2(-0.75,-1.4) 3(-0.25,-1.4) 4(0.25,-1.4) 5(0.75,-1.4) 6(1.25,-1.4) 7(1.25,1.4) 8(0.75,1.4) 9(0.25,1.4) 10(-0.25,1.4) 11(-0.75,1.4) 12(-1.25,1.4)
  rect 2.5x1.6 smd: 13(0,0)
USB4215-03-A:CONN_8p94X6p5X3p16_12L_GCC
  oval 1.108x2.308 hole 0.6x1.8: 13(-4.32,-1.151) 16(4.32,-1.151)
  oval 1.108x1.908 hole 0.6x1.4: 14(-4.32,2.849) 15(4.32,2.849)
  rect 0.6x1.15 smd: A1/B12(-3.2,3.424) A4/B9(-2.4,3.424) B1/A12(3.2,3.424) B4/A9(2.4,3.424)
  rect 0.3x1.15 smd: A5(-1.25,3.424) A6(-0.25,3.424) A7(0.25,3.424) A8(1.25,3.424) B5(1.75,3.424) B6(0.75,3.424) B7(-0.75,3.424) B8(-1.75,3.424)

## Nets
+1V15: C40.1 C57.1 C62.1 C64.1 C68.1 C71.1 C75.1 C81.1 C86.1 C91.1 C95.1 C99.1 C102.1 FB4.1 FB5.1 FB6.1 L2.1 R56.2 U4.37 U4.59 U4.73 U4.88 U4.122 U5.5
+3V3: C1.1 C2.1 C5.1 C9.1 C11.1 C13.1 C14.1 C16.1 C18.1 C22.1 C23.1 C24.1 C26.1 C29.1 C30.1 C31.1 C32.1 C33.1 C34.1 C35.1 C36.1 C45.1 C65.1 C66.1 C69.1 C70.1 C72.1 C82.1 C83.1 C87.1 C88.1 C92.1 C93.1 C97.1 C108.1 C109.1 FB1.2 FB7.1 FB8.1 FB10.1 FB11.1 FB13.1 FB14.1 FB15.1 J1.1 J2.1 J2.2 J3.1 J4.1 L1.2 R1.1 R11.2 R16.2 R17.2 R18.2 R31.2 R32.2 R33.2 R34.2 R35.2 R36.1 R37.2 R45.2 R46.2 R48.2 R59.2 R60.1 R61.2 R66.1 R68.2 R72.1 R73.2 R74.2 R75.2 R76.2 U1.6 U1.15 U1.26 U1.39 U1.52 U1.59 U1.73 U1.83 U1.94 U1.103 U1.115 U1.124 U1.137 U1.150 U1.158 U1.171 U1.185 U1.204 U5.10 U5.11 Y3.6
+3V3A: C10.1 FB1.1 U1.42
GND: C1.2 C2.2 C3.2 C4.2 C5.2 C6.1 C7.1 C8.2 C9.2 C10.2 C11.2 C12.2 C13.2 C14.2 C15.2 C16.2 C18.2 C19.2 C20.1 C22.2 C24.2 C25.2 C26.2 C27.2 C28.1 C29.2 C30.2 C31.2 C32.2 C33.2 C34.2 C35.2 C36.2 C38.2 C39.2 C40.2 C41.1 C42.2 C43.2 C44.2 C45.2 C46.2 C47.2 C48.2 C49.2 C50.2 C51.2 C52.2 C53.2 C54.2 C55.2 C56.1 C57.2 C58.2 C59.2 C60.2 C61.2 C62.2 C63.2 C65.2 C66.2 C67.2 C68.2 C69.2 C70.2 C71.2 C72.2 C73.2 C74.2 C75.2 C76.2 C77.2 C78.2 C79.2 C80.2 C81.2 C82.2 C83.2 C84.2 C85.2 C86.2 C87.2 C88.2 C89.2 C90.2 C91.2 C92.2 C93.2 C94.2 C95.2 C96.2 C97.2 C98.2 C99.2 C100.2 C101.2 C102.2 C103.2 C104.2 C105.2 C106.2 C107.2 C108.2 C109.2 D1.1 D2.1 D3.1 D4.1 FB2.2 H1.1 H2.1 H3.1 J1.3 J2.11 J2.12 J3.3 J5.2 J5.3 J9.1 J9.9 J9.10 J9.11 J9.14 J9.17 J9.20 J9.CAGE J11.1 J11.9 J11.10 J11.11 J11.14 J11.17 J11.20 J11.CAGE J13.13 J13.14 J13.15 J13.16 J13.A1/B12 J13.B1/A12 R12.1 R13.2 R14.2 R15.2 R29.1 R30.1 R38.1 R39.1 R40.1 R41.1 R42.1 R43.1 R44.1 R49.1 R50.1 R51.1 R52.1 R53.1 R54.1 R55.1 R57.1 R58.1 R62.1 R63.1 R64.1 R65.1 R67.1 R70.1 R71.1 SW1.1 SW1.2 SW2.2 U1.14 U1.25 U1.40 U1.51 U1.60 U1.72 U1.82 U1.93 U1.114 U1.125 U1.136 U1.149 U1.170 U1.184 U1.202 U2.2 U2.5 U2.6 U2.7 U2.8 U2.21 U2.23 U2.29 U3.2 U4.129 U5.8 U5.12 U5.13 Y2.2 Y3.3
PVDD_: C4.1 C19.1 D5.2 R4.1 U2.1 U2.28
VBUS: C3.1 C8.1 D6.3 J13.A4/B9 J13.B4/A9 Q1.4 R3.1 R4.2 U2.13 U2.14 U2.15 U2.16 U2.17 U2.18 U2.19 U2.27 U2.31 U3.5
VCCR1: C74.1 C77.1 FB7.2 J9.15
VCCR2: C104.1 C106.1 FB13.2 J11.15
VCCT1: C73.1 C76.1 FB8.2 J9.16
VCCT2: C105.1 C107.1 FB14.2 J11.16
VDDAH_PHY: C78.1 C79.1 C84.1 C89.1 C94.1 C98.1 C101.1 FB11.2 U4.6 U4.16 U4.25 U4.107 U4.116 U4.128
VDDAH_SRDS: C43.1 C47.1 FB15.2 U4.44 U4.52
VDDAL_PHY: C80.1 C85.1 C90.1 C96.1 C100.1 C103.1 FB4.2 U4.3 U4.15 U4.28 U4.104 U4.119
VDDAL_PLL: FB6.2 R19.1
VDDAL_SRDS: C52.1 C58.1 FB5.2 U4.47 U4.54
VDDIO: C44.1 C48.1 C53.1 C59.1 C60.1 C61.1 C63.1 C67.1 FB10.2 U4.32 U4.39 U4.58 U4.69 U4.77 U4.84 U4.92 U4.96
/MCU/BOOT_0: J1.2 J1.4 U1.197
/MCU/BST33: C17.2 D5.1 U2.20
/MCU/CC1: J13.A5 R13.1
/MCU/CC2: J13.B5 R15.1
/MCU/D+: J13.A6 J13.B6 U3.3
/MCU/D-: J13.A7 J13.B7 U3.1
/MCU/EN33: R3.2 U2.26
/MCU/ERR: R2.1 U1.135
/MCU/ETH_CRS_DV: U1.56 U4.89
/MCU/ETH_MDC: U1.36
/MCU/ETH_MDIO: U1.45
/MCU/ETH_REF_CLK: R24.1 U1.44
/MCU/ETH_RXD0: R28.1 U1.57
/MCU/ETH_RXD1: R20.1 U1.58
/MCU/ETH_TX_EN: R23.1 U1.91
/MCU/ETH_TXD0: R22.1 U1.104
/MCU/ETH_TXD1: R21.1 U1.105
/MCU/FB33: C23.2 R10.1 R11.1 R12.2 U2.24
/MCU/GT: D6.1 Q1.1 R14.1
/MCU/HEART: R9.1 U1.133
/MCU/IRQ0: U1.172 U4.60
/MCU/LAN RST: C38.1 R31.1 U1.169 U4.101
/MCU/NRST: J2.7 SW1.4 U1.34
/MCU/PDR_ON: J3.2 J3.4 U1.203
/MCU/PWR_PVD_IN: U1.195
/MCU/SCLK: J2.3 U1.159
/MCU/SPI_MISO: U1.55 U4.99
/MCU/SPI_NSS: R36.2 U1.53 U4.98
/MCU/SPI_SCK: U1.54 U4.97
/MCU/SPIMOSI: U1.173 U4.100
/MCU/STATUS: R8.1 U1.134
/MCU/SW33: C17.1 C21.1 L1.1 U2.4 U2.9 U2.10 U2.11 U2.12 U2.22 U2.30
/MCU/SWDIO: J2.5 U1.147
/MCU/SWO: J2.9 U1.192
/MCU/UART4_RX: J2.4 U1.11
/MCU/UART4_TX: J2.6 U1.43
/MCU/USB_D+: U1.146 U3.4
/MCU/USB_D-: U1.145 U3.6
/MCU/USR: SW2.4 U1.12
/MCU/XIN8: C6.2 R5.1 R6.1 Y1.2
/MCU/XOT8: C7.2 R5.2 R7.1 Y1.1
/MCU/XTAL_IN: R6.2 U1.32
/MCU/XTAL_OUT: R7.2 U1.33
/PHY/BOOT_MODE0: R62.2 U4.70
/PHY/BOOT_MODE1: R63.2 U4.68
/PHY/BOOT_MODE2: R64.2 U4.67
/PHY/CUPHY_MODE: R40.2 U4.82
/PHY/ENA115: C39.1 R37.1 U5.4
/PHY/ENCLK: R60.2 Y3.1
/PHY/FB115: C64.2 R56.1 R57.2 U5.6
/PHY/G0: J7.9 R35.1
/PHY/G1: J8.9 R33.1
/PHY/GPIO_MODE0: R53.2 U4.41
/PHY/GPIO_MODE1: R51.2 U4.40
/PHY/I2C0_SCL0: J9.5 R17.1 R26.1
/PHY/I2C0_SCL1: J11.5 R16.1 R25.1
/PHY/I2C0_SDA: J9.4 J11.4 R18.1 R27.1
/PHY/IIA: R27.2 U4.63
/PHY/IIC0: R26.2 U4.62
/PHY/IIC1: R25.2 U4.61
/PHY/ISET: R30.2 U4.127
/PHY/JTAG_EN: R65.2 U4.43
/PHY/LOOP_EN: R49.2 U4.42
/PHY/MGMT_MODE0: R73.1 U4.66
/PHY/MGMT_MODE1: R74.1 U4.65
/PHY/OT: R69.2 Y3.4
/PHY/P0_A+: J7.1 U4.102
/PHY/P0_A-: J7.2 U4.103
/PHY/P0_B+: J7.3 U4.105
/PHY/P0_B-: J7.6 U4.106
/PHY/P0_C+: U4.108
/PHY/P0_C-: U4.109
/PHY/P0_D+: U4.110
/PHY/P0_D-: U4.111
/PHY/P1_A+: J8.1 U4.112
/PHY/P1_A-: J8.2 U4.113
/PHY/P1_B+: J8.3 U4.114
/PHY/P1_B-: J8.6 U4.115
/PHY/P1_C+: U4.117
/PHY/P1_C-: U4.118
/PHY/P1_D+: U4.120
/PHY/P1_D-: U4.121
/PHY/PHY0_LED0: J7.10 U4.33
/PHY/PHY0_LED1: J7.11 U4.31
/PHY/PHY1_LED0: J8.10 R52.2 U4.35
/PHY/PHY1_LED1: J8.11 R50.2 R54.2 U4.34
/PHY/RCT0: C49.1 J7.5
/PHY/RCT1: C50.1 J8.5
/PHY/RESREF: R29.2 U4.51
/PHY/RGMII1_RXD2_RXER: U4.93
/PHY/RMII1_RXD0: R28.2 U4.95
/PHY/RMII1_RXD1: R20.2 U4.94
/PHY/RMII1_TXC_REFCLK: R24.2 R44.2 U4.87
/PHY/RMII1_TXCTL_TX_DV: R23.2 R43.2 U4.86
/PHY/RMII1_TXD0: R22.2 R42.2 U4.85
/PHY/RMII1_TXD1: R21.2 R41.2 U4.83
/PHY/S0_MOD_ABS: J9.6 R48.1 U4.80
/PHY/S0_RX+: J9.13 U4.50
/PHY/S0_RX-: J9.12 U4.49
/PHY/S0_RX_LOS: J9.8 R59.1 U4.91
/PHY/S0_TX+: J9.18 U4.48
/PHY/S0_TX-: J9.19 U4.46
/PHY/S0_TX_DISABLE: J9.3 R58.2 U4.79
/PHY/S0_TX_FAULT: J9.2 R61.1 U4.78
/PHY/S1_MOD_ABS: J11.6 R68.1 U4.76
/PHY/S1_RX+: J11.13 U4.57
/PHY/S1_RX-: J11.12 U4.56
/PHY/S1_RX_LOS: J11.8 R75.1 U4.90
/PHY/S1_TX+: J11.18 U4.55
/PHY/S1_TX-: J11.19 U4.53
/PHY/S1_TX_DISABLE: J11.3 R70.2 U4.75
/PHY/S1_TX_FAULT: J11.2 R76.1 U4.74
/PHY/SD_125M: J12.2 J12.4 U4.71
/PHY/SD_MODE0: R55.2 U4.36
/PHY/SFP_EN: R39.2 U4.81
/PHY/SGPIO_EN: J10.2 J10.4 U4.72
/PHY/SS115: C42.1 U5.7
/PHY/SW15: L2.2 U5.1 U5.2
/PHY/SYNCLKO: R69.1 U4.45
/PHY/TCT0: C54.1 J7.4
/PHY/TCT1: C55.1 J8.4
/PHY/VPLL: C37.1 R19.2 U4.126
/PHY/XIN25: C56.2 R47.1 Y2.3
/PHY/XMII_MODE1: U4.38
/PHY/XTAL_IN: R47.2 U4.123
/PHY/XTAL_OUT: C41.2 U4.124 Y2.1
/PHY/Y0: J7.12 R34.1
/PHY/Y1: J8.12 R32.1
CHASSIS: FB2.1 J7.8 J7.SH1 J7.SH2 J8.8 J8.SH1 J8.SH2
NET-(C21-PAD2): C21.2 R10.2
NET-(D1-A): D1.2 R1.2
NET-(D2-A): D2.2 R2.2
NET-(D3-A): D3.2 R8.2
NET-(D4-A): D4.2 R9.2
NET-(J10-PIN_1A): J10.1 R66.2
NET-(J10-PIN_2A): J10.3 R67.2
NET-(J12-PIN_1A): J12.1 R72.2
NET-(J12-PIN_2A): J12.3 R71.2
NET-(SW1-K): C20.2 SW1.3
NET-(SW2-K): C28.2 SW2.3
NET-(U4-RTN_PLL): C37.2 U4.125
NET-(U5-AVIN): C46.1 C51.1 R46.1 U5.9
NET-(Y2-GND__1): R38.2 R45.1 Y2.4
UNCONNECTED-(D6-NC-PAD2): D6.2
UNCONNECTED-(J2-PIN_4B-PAD8): J2.8
UNCONNECTED-(J2-PIN_5B-PAD10): J2.10
UNCONNECTED-(J7-NC-PAD7): J7.7
UNCONNECTED-(J8-NC-PAD7): J8.7
UNCONNECTED-(J9-RATE_SELECT-PAD7): J9.7
UNCONNECTED-(J11-RATE_SELECT-PAD7): J11.7
UNCONNECTED-(J13-SBU1-PADA8): J13.A8
UNCONNECTED-(J13-SBU2-PADB8): J13.B8
UNCONNECTED-(SW2-PAD1): SW2.1
UNCONNECTED-(U1-PA3-PAD50): U1.50
UNCONNECTED-(U1-PA8-PAD142): U1.142
UNCONNECTED-(U1-PA9-PAD143): U1.143
UNCONNECTED-(U1-PA10-PAD144): U1.144
UNCONNECTED-(U1-PA15-PAD160): U1.160
UNCONNECTED-(U1-PB0-PAD61): U1.61
UNCONNECTED-(U1-PB1-PAD62): U1.62
UNCONNECTED-(U1-PB2-PAD63): U1.63
UNCONNECTED-(U1-PB4-PAD193): U1.193
UNCONNECTED-(U1-PB5-PAD194): U1.194
UNCONNECTED-(U1-PB7-PAD196): U1.196
UNCONNECTED-(U1-PB8-PAD198): U1.198
UNCONNECTED-(U1-PB9-PAD199): U1.199
UNCONNECTED-(U1-PB10-PAD90): U1.90
UNCONNECTED-(U1-PB14-PAD106): U1.106
UNCONNECTED-(U1-PB15-PAD107): U1.107
UNCONNECTED-(U1-PC0-PAD35): U1.35
UNCONNECTED-(U1-PC2_C-PAD37): U1.37
UNCONNECTED-(U1-PC3_C-PAD38): U1.38
UNCONNECTED-(U1-PC6-PAD138): U1.138
UNCONNECTED-(U1-PC7-PAD139): U1.139
UNCONNECTED-(U1-PC8-PAD140): U1.140
UNCONNECTED-(U1-PC9-PAD141): U1.141
UNCONNECTED-(U1-PC10-PAD161): U1.161
UNCONNECTED-(U1-PC11-PAD162): U1.162
UNCONNECTED-(U1-PC12-PAD163): U1.163
UNCONNECTED-(U1-PC13-PAD8): U1.8
UNCONNECTED-(U1-PC14-PAD9): U1.9
UNCONNECTED-(U1-PC15-PAD10): U1.10
UNCONNECTED-(U1-PD0-PAD164): U1.164
UNCONNECTED-(U1-PD1-PAD165): U1.165
UNCONNECTED-(U1-PD2-PAD166): U1.166
UNCONNECTED-(U1-PD3-PAD167): U1.167
UNCONNECTED-(U1-PD4-PAD168): U1.168
UNCONNECTED-(U1-PD8-PAD108): U1.108
UNCONNECTED-(U1-PD9-PAD109): U1.109
UNCONNECTED-(U1-PD10-PAD110): U1.110
UNCONNECTED-(U1-PD11-PAD111): U1.111
UNCONNECTED-(U1-PD12-PAD112): U1.112
UNCONNECTED-(U1-PD13-PAD113): U1.113
UNCONNECTED-(U1-PD14-PAD116): U1.116
UNCONNECTED-(U1-PD15-PAD117): U1.117
UNCONNECTED-(U1-PE0-PAD200): U1.200
UNCONNECTED-(U1-PE1-PAD201): U1.201
UNCONNECTED-(U1-PE2-PAD1): U1.1
UNCONNECTED-(U1-PE3-PAD2): U1.2
UNCONNECTED-(U1-PE4-PAD3): U1.3
UNCONNECTED-(U1-PE5-PAD4): U1.4
UNCONNECTED-(U1-PE6-PAD5): U1.5
UNCONNECTED-(U1-PE7-PAD79): U1.79
UNCONNECTED-(U1-PE8-PAD80): U1.80
UNCONNECTED-(U1-PE9-PAD81): U1.81
UNCONNECTED-(U1-PE10-PAD84): U1.84
UNCONNECTED-(U1-PE11-PAD85): U1.85
UNCONNECTED-(U1-PE12-PAD86): U1.86
UNCONNECTED-(U1-PE13-PAD87): U1.87
UNCONNECTED-(U1-PE14-PAD88): U1.88
UNCONNECTED-(U1-PE15-PAD89): U1.89
UNCONNECTED-(U1-PF0-PAD16): U1.16
UNCONNECTED-(U1-PF1-PAD17): U1.17
UNCONNECTED-(U1-PF2-PAD18): U1.18
UNCONNECTED-(U1-PF3-PAD22): U1.22
UNCONNECTED-(U1-PF4-PAD23): U1.23
UNCONNECTED-(U1-PF5-PAD24): U1.24
UNCONNECTED-(U1-PF6-PAD27): U1.27
UNCONNECTED-(U1-PF7-PAD28): U1.28
UNCONNECTED-(U1-PF8-PAD29): U1.29
UNCONNECTED-(U1-PF9-PAD30): U1.30
UNCONNECTED-(U1-PF10-PAD31): U1.31
UNCONNECTED-(U1-PF11-PAD70): U1.70
UNCONNECTED-(U1-PF12-PAD71): U1.71
UNCONNECTED-(U1-PF13-PAD74): U1.74
UNCONNECTED-(U1-PF14-PAD75): U1.75
UNCONNECTED-(U1-PF15-PAD76): U1.76
UNCONNECTED-(U1-PG0-PAD77): U1.77
UNCONNECTED-(U1-PG1-PAD78): U1.78
UNCONNECTED-(U1-PG2-PAD129): U1.129
UNCONNECTED-(U1-PG3-PAD130): U1.130
UNCONNECTED-(U1-PG4-PAD131): U1.131
UNCONNECTED-(U1-PG5-PAD132): U1.132
UNCONNECTED-(U1-PG9-PAD178): U1.178
UNCONNECTED-(U1-PG10-PAD179): U1.179
UNCONNECTED-(U1-PG11-PAD180): U1.180
UNCONNECTED-(U1-PG12-PAD181): U1.181
UNCONNECTED-(U1-PG13-PAD182): U1.182
UNCONNECTED-(U1-PG14-PAD183): U1.183
UNCONNECTED-(U1-PG15-PAD191): U1.191
UNCONNECTED-(U1-PH2-PAD46): U1.46
UNCONNECTED-(U1-PH3-PAD47): U1.47
UNCONNECTED-(U1-PH4-PAD48): U1.48
UNCONNECTED-(U1-PH5-PAD49): U1.49
UNCONNECTED-(U1-PH6-PAD96): U1.96
UNCONNECTED-(U1-PH7-PAD97): U1.97
UNCONNECTED-(U1-PH8-PAD98): U1.98
UNCONNECTED-(U1-PH9-PAD99): U1.99
UNCONNECTED-(U1-PH10-PAD100): U1.100
UNCONNECTED-(U1-PH11-PAD101): U1.101
UNCONNECTED-(U1-PH12-PAD102): U1.102
UNCONNECTED-(U1-PH13-PAD151): U1.151
UNCONNECTED-(U1-PH14-PAD152): U1.152
UNCONNECTED-(U1-PH15-PAD153): U1.153
UNCONNECTED-(U1-PI0-PAD154): U1.154
UNCONNECTED-(U1-PI1-PAD155): U1.155
UNCONNECTED-(U1-PI2-PAD156): U1.156
UNCONNECTED-(U1-PI3-PAD157): U1.157
UNCONNECTED-(U1-PI4-PAD205): U1.205
UNCONNECTED-(U1-PI5-PAD206): U1.206
UNCONNECTED-(U1-PI6-PAD207): U1.207
UNCONNECTED-(U1-PI7-PAD208): U1.208
UNCONNECTED-(U1-PI8-PAD7): U1.7
UNCONNECTED-(U1-PI11-PAD13): U1.13
UNCONNECTED-(U1-PI12-PAD19): U1.19
UNCONNECTED-(U1-PI13-PAD20): U1.20
UNCONNECTED-(U1-PI14-PAD21): U1.21
UNCONNECTED-(U1-PI15-PAD64): U1.64
UNCONNECTED-(U1-PJ0-PAD65): U1.65
UNCONNECTED-(U1-PJ1-PAD66): U1.66
UNCONNECTED-(U1-PJ2-PAD67): U1.67
UNCONNECTED-(U1-PJ3-PAD68): U1.68
UNCONNECTED-(U1-PJ4-PAD69): U1.69
UNCONNECTED-(U1-PJ5-PAD95): U1.95
UNCONNECTED-(U1-PJ6-PAD118): U1.118
UNCONNECTED-(U1-PJ7-PAD119): U1.119
UNCONNECTED-(U1-PJ8-PAD120): U1.120
UNCONNECTED-(U1-PJ9-PAD121): U1.121
UNCONNECTED-(U1-PJ10-PAD122): U1.122
UNCONNECTED-(U1-PJ11-PAD123): U1.123
UNCONNECTED-(U1-PJ12-PAD174): U1.174
UNCONNECTED-(U1-PJ13-PAD175): U1.175
UNCONNECTED-(U1-PJ14-PAD176): U1.176
UNCONNECTED-(U1-PJ15-PAD177): U1.177
UNCONNECTED-(U1-PK0-PAD126): U1.126
UNCONNECTED-(U1-PK1-PAD127): U1.127
UNCONNECTED-(U1-PK2-PAD128): U1.128
UNCONNECTED-(U1-PK3-PAD186): U1.186
UNCONNECTED-(U1-PK4-PAD187): U1.187
UNCONNECTED-(U1-PK5-PAD188): U1.188
UNCONNECTED-(U1-PK6-PAD189): U1.189
UNCONNECTED-(U1-PK7-PAD190): U1.190
UNCONNECTED-(U2-NC-PAD3): U2.3
UNCONNECTED-(U2-PG-PAD25): U2.25
UNCONNECTED-(U4-GPIO_29-PAD64): U4.64
UNCONNECTED-(U4-P2_AN-PAD2): U4.2
UNCONNECTED-(U4-P2_AP-PAD1): U4.1
UNCONNECTED-(U4-P2_BN-PAD5): U4.5
UNCONNECTED-(U4-P2_BP-PAD4): U4.4
UNCONNECTED-(U4-P2_CN-PAD8): U4.8
UNCONNECTED-(U4-P2_CP-PAD7): U4.7
UNCONNECTED-(U4-P2_DN-PAD10): U4.10
UNCONNECTED-(U4-P2_DP-PAD9): U4.9
UNCONNECTED-(U4-P3_AN-PAD12): U4.12
UNCONNECTED-(U4-P3_AP-PAD11): U4.11
UNCONNECTED-(U4-P3_BN-PAD14): U4.14
UNCONNECTED-(U4-P3_BP-PAD13): U4.13
UNCONNECTED-(U4-P3_CN-PAD18): U4.18
UNCONNECTED-(U4-P3_CP-PAD17): U4.17
UNCONNECTED-(U4-P3_DN-PAD20): U4.20
UNCONNECTED-(U4-P3_DP-PAD19): U4.19
UNCONNECTED-(U4-P4_AN-PAD22): U4.22
UNCONNECTED-(U4-P4_AP-PAD21): U4.21
UNCONNECTED-(U4-P4_BN-PAD24): U4.24
UNCONNECTED-(U4-P4_BP-PAD23): U4.23
UNCONNECTED-(U4-P4_CN-PAD27): U4.27
UNCONNECTED-(U4-P4_CP-PAD26): U4.26
UNCONNECTED-(U4-P4_DN-PAD30): U4.30
UNCONNECTED-(U4-P4_DP-PAD29): U4.29
UNCONNECTED-(U5-PG-PAD3): U5.3
UNCONNECTED-(Y3-NC-PAD2): Y3.2
UNCONNECTED-(Y3-NC-PAD5): Y3.5
VCAP1: C15.1 U1.148
VCAP2: C12.1 U1.92
VCON: J5.1 Q1.3
VREF+: C25.1 C27.1 J4.2 U1.41

## Via types
v1: diameter 0.45, hole 0.25, Top Layer to Bottom Layer, 432 vias
v2: diameter 0.8, hole 0.4, Top Layer to Bottom Layer, 10 vias
v3: diameter 0.61, hole 0.305, Top Layer to Bottom Layer, 19 vias

## Routing (per net, layer and track width the routed paths; a pad name or vN(x,y) marks a point on that pad's centre or on a via; arc(x,y) is an arc through that point)
+1V15: length 148.4
  Top Layer w0.16: 40.24,35.64 40.24,34.67 v1(40.17,34.6)
  Top Layer w0.2: U4.73 26.83,30.98 arc(26.71,31) 26.61,31.06 v1(26.25,31.43) ; U4.122 39.45,19.19 38.77,18.53 ; 26.22,25.84 27.08,24.98 U4.88 ; 31.44,36.3 31.44,36.71 30.56,36.71 30.56,38.49 arc(30.54,38.6) 30.47,38.7 29.83,39.35 ; 45.25,13.69 45.25,14.79
  Top Layer w0.3: 43.45,37.39 43.45,36.06 43.45,36.05 43.44,36.04
  Top Layer w0.35: v1(26.91,37.09) 26.92,37.1 26.92,37.79 ; v1(38.75,17.8) 38.77,17.83 38.77,18.53 ; 57.3,33.2 57.32,33.22 59.99,33.22 arc(60.11,33.25) 60.2,33.31
  Top Layer w0.6: v1(44.73,14.79) 45.03,14.48 45.03,13.34 ; v1(44.73,14.79) 45.5,14.79 ; v1(44.73,14.79) 43.97,14.79 ; 26.22,25.84 26.01,25.84 arc(25.9,25.86) 25.8,25.93 v1(25.7,26.03) ; 53.23,35.2 59.04,35.2
  Top Layer w0.8: v1(24.98,14.83) 24.96,14.84 24.96,17.72 24.96,17.72 ; 24.96,17.72 24.96,18.28 ; 24.96,17.72 24.96,16.84 ; 30.27,40.83 29.91,40.47 arc(29.85,40.38) 29.83,40.26 v1(29.83,39.95) 29.83,39.35
  In2.Cu w0.3: v1(40.17,34.6) 40.68,35.1 arc(40.76,35.16) 40.85,35.18 42.47,35.18 arc(42.57,35.19) 42.65,35.25 v1(43.44,36.04)
  In2.Cu w0.4: v1(26.25,31.43) 25.83,31.85 25.83,34 26.91,35.08 v1(26.91,37.09)
  In4.Cu w0.4: v1(26.91,37.09) 26.91,38.26 28.6,39.95 v1(29.83,39.95)
  In4.Cu w0.5: 27.73,25.97 27.73,22.06 24.98,19.3 24.98,18.82 ; 27.73,25.97 27.73,29.95 v1(26.25,31.43) ; 27.73,25.97 27.67,26.03 v1(25.7,26.03) ; 38.75,18.82 v1(38.75,17.8) ; 38.75,18.82 24.98,18.82 ; 38.75,18.82 46.09,18.82 48.43,21.17 48.43,29.68 53.89,35.14 58.59,35.14 59.33,34.4 v1(60.65,34.4) v1(61.45,34.4) 62.08,34.4 ; v1(62.9,34.2) 62.7,34.4 62.08,34.4 ; 24.98,18.82 v1(24.98,14.83) ; 62.08,34.4 v1(62.23,34.55)
  Bottom Layer w0.35: v1(38.75,17.8) 38.75,16.5 40.03,15.22 44.3,15.22 v1(44.73,14.79)
  Bottom Layer w0.4: v1(43.44,36.04) 43.44,37.08 42.84,37.68 41.19,37.68 40.56,37.04 40.56,36.16 40.18,35.77 30.4,35.77 28.49,37.68 27.49,37.68 v1(26.91,37.09)
  vias: v1(62.25,33.85)
+3V3: length 528.6
  Top Layer w0.2: v1(63.63,69.88) 63.65,69.9 63.65,71.25 ; v1(62.29,39.36) 62.2,39.45 arc(62.14,39.54) 62.11,39.66 ; 84.58,44.33 86.26,44.33 ; 62.11,41.87 62.11,40.16
  Top Layer w0.254: 48.83,56.35 51.39,56.35 51.76,56.73 51.76,59.31 51.77,59.33 ; 51.77,59.33 U1.73 56.69,59.33 ; 51.77,59.33 50.31,59.33 ; 79.65,41.9 79.65,40.73 80.2,40.18 ; 84.58,67.33 86.18,67.33 ; 56.69,59.33 56.69,61.34 58.42,63.07 58.42,64.98 57.07,66.33 U1.59 54.45,66.33 arc(54.33,66.3) 54.24,66.24 54.04,66.04 arc(53.94,65.97) 53.83,65.95 53.48,65.95 ; 56.69,59.33 56.69,54.67 56.35,54.33 U1.83 53.05,54.33 ; 75.65,71.25 75.65,72.54 75.19,73 ; 50.19,72.79 50.84,72.79 v1(50.87,72.82) ; v1(48.16,69.64) 48.22,69.58 48.77,69.58 ; 66.27,40.16 66.65,40.54 66.65,41.9 ; 47.21,62.19 47.21,61.41 arc(47.23,61.3) 47.3,61.2 47.61,60.89 arc(47.71,60.82) 47.82,60.8 v1(48.65,60.8) 49.5,60.8 arc(49.62,60.78) 49.71,60.71 50.16,60.26 arc(50.23,60.17) 50.25,60.05 50.25,59.39 ; 50.16,66.7 50.82,66.04 arc(50.92,65.97) 51.03,65.95 53.48,65.95 ; 53.48,65.95 53.48,65.95 53.48,65.31 ; 84.58,50.83 86.16,50.83 ; 55.23,48.83 54.22,48.83 53.47,48.08 ; v1(50.99,76.51) 50.14,76.51 ; 70.15,71.25 70.15,72.85 ; 80.15,71.25 80.15,72.72 ; 84.58,57.83 86.24,57.83 ; 55.23,44.33 53.65,44.33 ; 73.15,41.9 v1(73.15,40.78) 73.15,40.32
  Top Layer w0.3: v1(27.35,42.48) 25.35,42.48 arc(25.23,42.45) 25.14,42.39 24.71,41.96 arc(24.64,41.86) 24.62,41.75 24.62,40.92 ; 45.23,39.35 44.29,40.29 arc(44.22,40.38) 44.2,40.5 44.2,42 arc(44.18,42.12) 44.11,42.21 v1(43.7,42.62) ; 24.62,40.92 24.62,36.17 ; 24.62,40.92 22.73,40.92
  Top Layer w0.35: 48.85,74.84 50.14,73.55 ; v1(74.33,73) 74.33,73 75.19,73 ; 31.2,13.54 31.2,11.24 34.55,7.9 v1(37.33,7.9) 40.4,7.9 41.99,9.49 arc(42.05,9.58) 42.08,9.7 42.08,10.38 ; 23.75,26.82 23.75,33.71 arc(23.77,33.83) 23.84,33.93 24.62,34.71 ; 23.75,26.82 22.73,26.82 ; 23.75,26.82 23.75,24.62 arc(23.73,24.51) 23.66,24.41 22.91,23.66 arc(22.85,23.57) 22.83,23.45 v1(22.83,21.08) 22.88,21.12 24.52,21.12 24.92,20.74 24.92,19.97 ; 79.87,73 79.2,73 v1(79.15,73.05) ; 48.55,14.6 48.55,14.67 arc(48.52,14.79) 48.46,14.88 48.2,15.14 ; 48.55,14.6 48.55,14.6 48.55,12.92 arc(48.53,12.81) 48.46,12.71 48.14,12.39 arc(48.04,12.32) 47.93,12.3 43.17,12.3 arc(43.06,12.28) 42.96,12.21 42.16,11.41 arc(42.1,11.32) 42.08,11.2 42.08,10.38 ; 48.55,14.6 48.55,13.72 ; 70.38,73.08 70.8,73.5 v1(70.8,74.08) ; 22.73,7.59 25.1,9.97 25.1,12.08 v1(25.13,12.1) ; 86.33,67.48 87.08,67.48 v1(87.13,67.53) ; 57.15,71.25 v1(56.65,71.25) 56.48,71.25 arc(56.36,71.27) 56.27,71.34 ; 42.08,10.38 42.07,10.37 R45.2 ; 70.42,6.88 67.06,6.88 arc(66.95,6.9) 66.85,6.96 65.17,8.65 v1(56.22,8.65) 54,8.65 53.46,8.11 arc(53.39,8.01) 53.37,7.9 ; 48.16,15.14 47.02,16.28
  Top Layer w0.6: v3(53.33,31.2) v3(53.33,31.85) ; J2.1 J2.2 87.19,43.59 arc(87.08,43.62) 86.98,43.68 86.3,44.37 ; 51.15,30.29 52.9,30.29 ; v1(86.33,49.5) 86.33,50.66 ; v1(86.33,57) 86.33,57.74
  Top Layer w0.75: 48.76,69.57 48.76,66.65 ; 48.76,66.65 48.76,65.2 ; 48.76,66.65 50.11,66.65 ; 62.11,40.16 62.29,39.99 v1(62.29,39.36) ; 61.48,25.18 61.48,27.35 arc(61.45,27.47) 61.39,27.56 60.83,28.12 arc(60.74,28.18) 60.62,28.21 57.87,28.21 ; 47.23,51.53 47.31,51.61 arc(47.38,51.71) 47.4,51.82 47.4,53.38 ; 48.85,48.38 49.84,49.36 arc(49.93,49.43) 50.05,49.45 50.25,49.45 ; 50.19,72.12 50.19,73.5 ; 57.69,24.7 61.17,24.7 arc(61.39,24.79) 61.48,25 ; 58.33,74.58 58.37,74.58 58.37,78.92 ; 53.48,44.16 53.48,44.77 v1(53.48,44.78) ; v1(66.27,38.9) 66.27,40.16 ; v1(80.92,40.05) 80.45,40.05 arc(80.33,40.07) 80.24,40.14 ; v1(47.77,51.15) 47.49,51.44 arc(47.42,51.53) 47.4,51.65 ; J4.1 56.03,79.18 56.01,79.2 56.01,80.03 ; 60.81,76.08 58.59,76.08 arc(58.48,76.1) v1(58.38,76.16)
  Top Layer w0.8: 45.57,16.28 47.02,16.28 ; 40.16,39.35 40.16,40.08 ; 24.62,34.71 24.62,36.17 ; 46.69,39.34 45.24,39.34 ; 40.16,40.76 40.23,40.83
  Top Layer w0.85: 53.48,44.16 51.94,44.16 ; 51.94,44.16 51.94,43.51 50.23,43.51 50.23,40.3 arc(50.21,40.19) 50.14,40.09 50.05,40 ; 51.94,44.16 51.94,46.4 ; 51.94,46.4 51.94,48.08 53.47,48.08 ; 51.94,46.4 51.86,46.48 48.88,46.48 48.88,48.35 48.85,48.38 ; 40.16,40.08 40.16,42.17 arc(40.13,42.29) 40.07,42.39 39.55,42.9 v1(39.52,42.9) ; 51.74,40.11 50.28,40.11 arc(50.16,40.08) 50.07,40.02
  In2.Cu w0.35: v1(56.22,8.65) 56.22,9.9 ; v1(37.33,7.9) 37.33,9.9
  In2.Cu w0.6: 86.33,58.05 89.69,58.05 J1.1 ; 86.33,58.05 86.33,64.39 ; 86.33,58.05 v1(86.33,57) v1(86.33,49.5) ; 86.33,64.39 89.8,64.39 J3.1 ; 86.33,64.39 86.33,66.73 v1(87.13,67.53)
  In2.Cu w0.75: v1(25.13,12.1) 25.76,12.74 29.54,12.74 32.38,9.9 57.32,9.9 58.09,10.66 58.09,12.86 60.13,14.9 63.82,14.9 65.05,16.12 v1(65.05,19.93) v1(65.05,21.18) 65.05,29 ; v3(53.33,31.85) v3(53.33,31.2) 53.33,29.57 53.87,29.03 65.02,29.03 65.05,29 ; 65.05,29 65.05,34.41 66.74,36.1 68.52,36.1 70.3,37.88 v1(70.3,40.05)
  In4.Cu w0.254: v1(50.87,72.82) 50.35,72.82 50.14,73.03 ; 48.77,69.58 48.22,69.58 v1(48.16,69.64)
  In4.Cu w0.75: J2.2 86.33,46.37 v1(86.33,49.5) ; 58.25,79.18 58.25,78.9 arc(58.27,78.78) 58.34,78.69 58.37,78.66 58.37,76.18 v1(58.38,76.16) ; 58.25,79.18 J4.1 ; 58.25,79.18 56.67,79.18 arc(56.56,79.15) 56.46,79.09 53.97,76.6 arc(53.87,76.53) 53.76,76.51 50.14,76.51 49.26,75.63 arc(49.2,75.53) 49.17,75.42 49.17,74.72 arc(49.2,74.61) 49.26,74.51 50.05,73.73 arc(50.11,73.63) 50.14,73.52 ; 50.13,51.1 50.13,51.15 ; 50.13,51.1 50.15,51.12 50.13,51.15 ; 50.13,51.1 50.13,47.08 52.38,44.83 52.38,44.78 v1(53.48,44.78) ; 50.13,51.15 v1(47.77,51.15) ; 50.13,51.15 50.13,54.58 arc(50.15,54.69) 50.21,54.79 50.75,55.32 arc(50.81,55.42) 50.84,55.54 50.84,58.71 arc(50.81,58.83) 50.75,58.93 48.96,60.71 arc(48.87,60.78) 48.75,60.8 v1(48.65,60.8) 48.68,60.83 arc(48.74,60.92) 48.77,61.04 48.77,69.72 arc(48.79,69.83) 48.85,69.93 50.05,71.12 arc(50.11,71.22) 50.14,71.33 50.14,73.52 ; 50.14,73.52 50.14,73.55
  Bottom Layer w0.3: 39.8,42.62 v1(39.52,42.9) ; 39.8,42.62 39.8,42.67 36.52,45.95 28,45.95 arc(27.88,45.93) 27.79,45.86 27.01,45.09 arc(26.95,44.99) 26.92,44.88 26.92,43.02 arc(26.95,42.91) 27.01,42.81 v1(27.35,42.48) ; 39.8,42.62 v1(43.7,42.62)
  Bottom Layer w0.35: v1(22.83,21.08) 22.84,21.06 22.84,14.39 v1(25.13,12.1)
  Bottom Layer w0.6: 79.27,71.53 79.24,71.56 arc(79.17,71.66) 79.15,71.77 v1(79.15,73.05) ; 79.27,71.53 74.1,71.53 ; 79.27,71.53 83.7,71.53 arc(83.82,71.5) 83.91,71.44 85.1,70.25 arc(85.16,70.15) 85.19,70.04 85.19,68.49 arc(85.21,68.37) 85.28,68.27 85.94,67.61 arc(86.03,67.55) 86.15,67.53 v1(87.13,67.53) ; 63.67,71.53 63.63,71.48 v1(63.63,69.88) ; 63.67,71.53 63.32,71.53 arc(63.21,71.55) 63.11,71.61 61.77,72.95 arc(61.68,73.02) 61.56,73.04 v1(61.41,73.04) 58.58,73.04 arc(58.47,73.02) 58.37,72.95 58.37,72.95 ; 63.67,71.53 70.75,71.53 ; 74.1,71.53 70.75,71.53 ; 74.1,71.53 74.24,71.66 arc(74.3,71.76) 74.33,71.87 v1(74.33,73) ; 70.75,71.53 70.8,71.58 v1(70.8,74.08)
  Bottom Layer w0.75: v1(73.15,40.78) 73.13,40.75 73.13,40.05 ; v1(62.29,39.36) 62.35,39.36 62.85,38.87 69.05,38.87 70.23,40.05 v1(70.3,40.05) 73.13,40.05 ; v1(56.65,71.25) 57.3,71.25 arc(57.42,71.27) 57.51,71.34 58.28,72.1 arc(58.34,72.2) 58.37,72.32 58.37,76.15 v1(58.38,76.16) ; 73.13,40.05 v1(80.92,40.05) 81.83,40.05 arc(81.94,40.07) 82.04,40.14 85.41,43.51 arc(85.5,43.57) 85.62,43.59 J2.2
  vias: v1(65.04,18.95) v1(65,17) v1(65.08,18.05)
+3V3A: length 5.6
  Top Layer w0.2: 62.15,71.25 62.15,72.34 59.96,72.34 59.96,73.04 58.39,73.04
GND: length 242.7
  Top Layer w0.18: 57.65,71.25 57.65,70.09 v1(57.66,70.08) ; 56.89,64.11 v1(57.48,63.53) ; 75.43,22.49 75.43,22 ; 53.49,55.54 54.2,54.83 55.23,54.83
  Top Layer w0.2: 24.65,24.28 24.67,24.25
  Top Layer w0.22: 27.01,39.34 26.44,39.34 arc(26.32,39.31) 26.22,39.25 25.46,38.48 arc(25.39,38.39) 25.37,38.27 25.37,34.05 arc(25.35,33.94) 25.28,33.84 24.67,33.23 24.67,31.46
  Top Layer w0.254: v1(76.83,73.55) 76.74,73.47 76.74,73 ; v1(85.58,31.66) 85.54,31.61 84.7,31.61 ; v1(44.25,50.48) 44.23,50.46 J11.14 ; J11.1 33.79,54.86 v1(33.78,54.84) ; 46.71,24.28 47.4,24.28 v1(47.4,24.28) ; 24.47,26.04 24.41,26.1 24.41,31.2 24.47,31.26 ; 61.65,41.9 61.65,43.06 62.54,43.95 v1(64.84,43.95) ; v1(67.65,43.88) 67.15,43.38 U1.125 67.15,40.84 67.83,40.16 ; v1(21.5,17.77) 21.5,17.41 21.88,17.03 22.8,17.03 ; v1(56.58,49.32) 56.57,49.33 55.23,49.33 ; 81.66,76.48 81.66,77.13 v1(81.65,77.14) ; v1(54.07,42.62) 54.05,42.61 53.48,42.61 ; 84.58,50.33 83.43,50.33 v1(83.18,50.58) ; v1(36.74,15.94) 36.74,15.81 36.74,15.81 36.74,15.09 ; 51.74,37.38 51.74,36.92 51.73,36.9 ; 51.74,37.38 51.73,37.38 51.73,36.9 ; 51.74,37.38 v1(52.46,37.38) ; 51.74,37.38 51.74,38.56 ; 50.39,70.58 50.4,70.59 v1(50.9,70.59) ; U2.2 53.27,17.05 v1(53.27,17.05) ; v1(85.9,40.98) 85.27,40.35 84.7,40.35 ; v1(61.39,75.25) 61.41,75.23 61.41,74.59 ; 48.67,62.2 50.98,62.2 52,63.23 v1(53.43,63.23) ; v1(36.17,47.71) 36.12,47.66 J11.10 ; 59.96,74.59 59.96,75.23 v1(59.94,75.25) ; 51.73,36.9 51.73,35.9 51.31,35.48 v1(50.99,35.48) 50.93,35.43 50.93,33.69 ; 84.58,57.33 82.83,57.33 v1(82.77,57.28) ; 55.23,17.42 v1(55.54,17.11) ; v1(57.48,63.53) 56.6,64.41 56.6,65.53 56.3,65.83 55.23,65.83 ; v1(62.38,68.5) 62.38,69.34 63.15,70.11 63.15,71.25 ; 88.08,39.78 87.5,39.2 87.5,38.66 ; v1(72.33,44.12) 72.65,43.8 72.65,41.9 ; 53.49,60.61 54.18,59.91 arc(54.28,59.85) 54.39,59.83 55.23,59.83 ; v1(83.17,66.34) 83.19,66.33 84.58,66.33 ; 54.46,30.68 54.46,31.12 54.54,31.2 ; 88.08,31.14 87.5,31.71 87.5,32.26 ; 37.06,18.53 v1(36.67,18.14) ; v1(41.46,53.46) 41.46,53.07 41.67,52.86 J11.17 ; 55.87,31.99 55.08,31.2 54.54,31.2 ; 43.45,39.29 43.45,39.24 44.11,38.57 45.85,38.57 46.12,38.31 ; v1(48.73,72.91) 48.73,73.62 ; 50.16,65.15 49.69,64.68 v1(49.61,64.68) ; 54.54,31.2 54.45,31.2 ; v1(82.05,72.98) 82.04,73 81.42,73 ; 47.32,59.38 v1(48.08,59.38) 48.79,59.38 ; 70.65,71.25 v1(70.65,70.31) ; 55.12,33.2 U5.8 53.04,33.2 52.54,33.7 51.81,33.7 ; v1(56.77,36.38) 56.77,36.7 57.17,37.1 ; 79.15,41.9 79.15,43.2 79.52,43.58 ; J11.11 42.04,48.06 41.87,47.89 v1(41.87,47.41) ; 82.98,35.47 82.17,35.47 v1(82.16,35.48) ; 68.3,12.68 v1(73.42,12.68) 74.17,12.68 ; v1(62.35,76.8) 62.35,76.09 ; 22.64,30.99 v1(22.14,31.5) ; v1(36.16,48.47) 36.15,48.46 J11.9 ; v1(64.7,75.5) 64.36,75.16 64.36,74.59 ; v1(23.5,35.98) 23.49,35.99 22.73,35.99 ; 75.43,22 75.43,21.68 v1(75.35,21.6) ; 74.18,11.31 68.3,11.31 ; 76.15,71.25 v1(76.15,70.32)
  Top Layer w0.3: 27.91,39.34 27.01,39.34 ; 46.69,38.29 46.71,38.31 ; 46.71,38.31 46.76,38.36 47.25,38.36 47.25,38.35 47.7,38.35 ; 46.71,38.31 46.12,38.31 ; 47.3,43.53 47.3,42.82 arc(47.32,42.71) 47.39,42.61 47.61,42.39 arc(47.68,42.29) 47.7,42.18 47.7,40.8 ; 47.7,40.8 47.67,40.83 46.77,40.83 ; 47.7,40.8 47.7,38.35 ; 47.7,38.35 48.6,38.35
  Top Layer w0.35: v1(86.33,69.95) 86.33,69.95 86.33,69.03 ; v1(64.36,40.12) 64.32,40.16 63.67,40.16 ; 59.01,40.14 v1(58.53,40.62)
  Top Layer w0.4: 38.66,39.34 38.66,40.81 ; 28.38,39.34 27.91,39.34 arc(27.8,39.36) 27.7,39.42 v1(27.4,39.73) 27.01,39.34 ; 86.31,52.23 86.31,54.72 87.89,56.3 J2.12 ; 35.46,39.84 35.46,39.27
  Top Layer w0.5: D4.1 v3(76.29,1.63) D3.1 v3(73.83,1.63) D2.1 v3(71.54,1.63) D1.1
  Top Layer w0.6: v1(35.44,42.61) 35.46,42.58 35.46,39.84 ; 24.65,25.82 24.65,22.15 ; 52.95,28.8 53.73,28.8 54.46,29.53 54.46,30.68 v1(54.46,30.69) ; 31.82,40.83 31.54,40.55 31.54,39.29 ; 46.6,35.65 v1(46.29,35.96) ; 64.42,25.18 64.42,26.35 v1(63.2,27.58) ; 52.09,15.38 52.09,16.05 v1(52.08,16.06) ; 41.71,39.34 43.4,39.34 ; 47.3,43.53 48.76,43.53 ; v1(35.17,15.15) 35.23,15.09 36.74,15.09 36.74,15.86 36.78,15.89 ; 35.35,10.28 v1(35.35,8.76) ; 34.09,39.29 v1(34.09,40.2) ; 43.35,13.34 v1(42.89,13.81) ; v1(39.21,8.77) 39.17,8.8 39.17,10.26 ; 40.63,13.7 40.63,14.26 v1(40.63,14.27) ; 54.42,23.65 54.42,25.14 ; 47.05,14.79 47.05,14.08 v1(47,14.03) ; 57.69,26.65 59.64,26.65 ; 46.71,22.32 46.71,28.25 ; v1(44.02,16.03) 44.02,16.72 ; v1(52.9,28.08) 52.9,28.74 ; 46.71,32.73 46.71,30.84 ; 41.6,40.83 41.6,39.58 arc(41.62,39.46) 41.69,39.36 ; 46.69,37.79 46.69,38.29 ; v1(52.17,28.75) 52.91,28.75
  Top Layer w0.7: v1(43.33,8.66) 43.35,8.68 43.35,10.34
  Top Layer w0.75: 48.95,53.38 50.23,53.38 50.25,53.4 ; 53.23,38.56 53.23,39.33 53.47,39.58 ; 53.49,55.54 52.05,55.54 52.05,54.83 48.9,54.83 ; 50.25,53.4 50.25,54.8 ; 50.25,53.4 50.25,51 51.89,51 ; v1(53.59,56.12) 53.59,55.64 ; v1(53.42,45.93) 53.42,46.48 ; 51.92,51.02 51.95,50.99 51.95,49.56 50.5,48.11 arc(50.4,48.05) 50.29,48.03
  Top Layer w0.8: 26.51,16.84 29.4,16.84 ; 51.8,33.69 49.84,33.69 ; 38.61,39.29 31.54,39.29 ; 47.02,18.35 47.24,18.14 arc(47.33,18.07) 47.45,18.05 48.17,18.05 ; 47.02,18.35 47.02,22.02 arc(46.94,22.23) 46.73,22.32 ; 47.02,18.35 47.02,17.83 ; 51.74,38.56 53.23,38.56 53.23,37.1 57.17,37.1 ; 46.71,35.65 46.71,32.73 ; 35.6,17.05 32.77,17.05 ; 48.52,18.05 48.17,18.05 ; 48.17,18.05 arc(48.38,17.96) 48.47,17.75 48.47,16.33
  In4.Cu w0.254: v2(53.33,18.78) 53.27,18.72 v1(53.27,17.05)
  Bottom Layer w0.254: 88.08,39.78 88.08,40.33 87.42,40.98 v1(85.9,40.98)
  Bottom Layer w0.6: v2(53.33,18.78) v2(53.33,20.93)
  vias: v1(22.13,18.44) v1(22.75,9.33) v1(22.85,37.38) v1(23.02,12.7) v1(24.08,11.22) v1(26.48,11.22) v1(30.4,16.35) v1(32.77,17.62) v1(33.73,67.15) v1(33.73,66.39) v1(33.92,15) v1(33.92,14.2) v1(34.18,17.69) v1(34.97,17.58) v1(35.15,14.45) v1(35.13,13.68) v1(36.24,73.57) v1(36.48,22.88) v1(36.88,5.41) v1(37.73,22.8) v1(37.83,23.6) v1(38.1,5.25) v1(39.17,79.88) v1(39.58,23.38) v1(39.65,21.83) v1(40.83,70.29) v1(40.95,23.7) v1(40.96,52.12) v1(41.37,72.23) v1(41.77,23.7) v1(42.88,55.9) v1(43.66,55.91) v1(43.95,74.4) v1(43.85,66) v1(44.03,47.39) v1(45.33,50.1) v1(45.67,48.62) v1(45.77,79.98) v1(46.8,25.75) v1(47.23,28.3) v1(47.3,30.5) v1(47.42,29.6) v1(47.75,31.15) v1(48.33,31.73) v1(49.69,33.23) v1(50.05,27.03) v1(50.1,22.45) v1(50.35,28.23) v1(50.65,74.98) v1(50.75,23.85) v1(52.08,75.15) v1(52.42,78.68) v1(53.02,72.53) v1(53.49,61.14) v1(53.88,73.1) v1(53.89,71.59) v1(53.96,40.03) v1(54.38,25.7) v1(54.43,24.43) v1(54.5,38.28) v1(55.8,42.58) v1(56.2,17.12) v1(56.85,76.62) v1(57.63,26.15) v1(58.9,52.35) v1(59.65,26.1) v1(59.95,77.43) v1(60.52,67.75) v1(60.55,53.35) v1(60.83,36) v1(62.4,74.9) v1(63.05,49.18) v1(63.03,6.94) v1(63.58,60.12) v1(63.65,55.05) v1(63.98,13.6) v1(64.63,76.12) v1(64.58,68.62) v1(65.1,13.3) v1(65.92,73.23) v1(66.13,75.83) v1(67.13,12.55) v1(68.17,60.9) v1(68.42,73.38) v1(68.46,40.18) v1(69.02,11.33) v1(69.08,12.72) v1(69.35,72.53) v1(70.25,80.08) v1(70.25,21.65) v1(70.52,12.72) v1(71.98,12.7) v1(72,11.33) v1(72.4,73.1) v1(72.77,59.08) v1(72.95,80.08) v1(73.45,11.33) v1(74.17,78.33) v1(74.8,52.05) v1(74.8,39.12) v1(75,11.18) v1(75.13,80.08) v1(75.13,61.15) v1(75.65,48.23) v1(75.98,38.58) v1(76.98,15.31) v1(78.05,80.03) v1(78.7,58.88) v1(78.69,38.07) v1(79.52,43.56) v1(80.75,39.09) v1(81.67,68.93) v1(82.08,64.05) v1(87.26,47.91) v1(87.48,59.25) v1(87.69,50.16) v2(15.85,3.9) v2(15.88,2.58) v2(16.5,3.2) v2(53.35,19.88) v2(55.88,33.28) v2(55.87,32.45) v2(55.88,31.6) v3(17.15,23.48) v3(18.5,23.48) v3(19.98,23.48) v3(20.28,40.05) v3(20.28,38.08) v3(67.1,26.5) v3(67.1,25.17) v3(68.75,26.45) v3(70.42,26.49) v3(70.42,24.83) v3(70.35,20.25) v3(77.45,13.08)
